# EasyEDA Pro project six-port-baseboard-v01.epro, schematic 六接口底板_V01, sheets 1 to 4 of 12

## Sheets
1 01_FL胎温控制器: Assembly Variant: Basic; Board Name: Board1; Create Date: 2026-10-24; Page Name: P1; Project Name: 六接口中控底板 V0.1 工程样机; Schematic Name: Schematic1; Update Date: 2026-10-24; Company: 嘉立创EDA; Page Size: A4; Version: V1.0
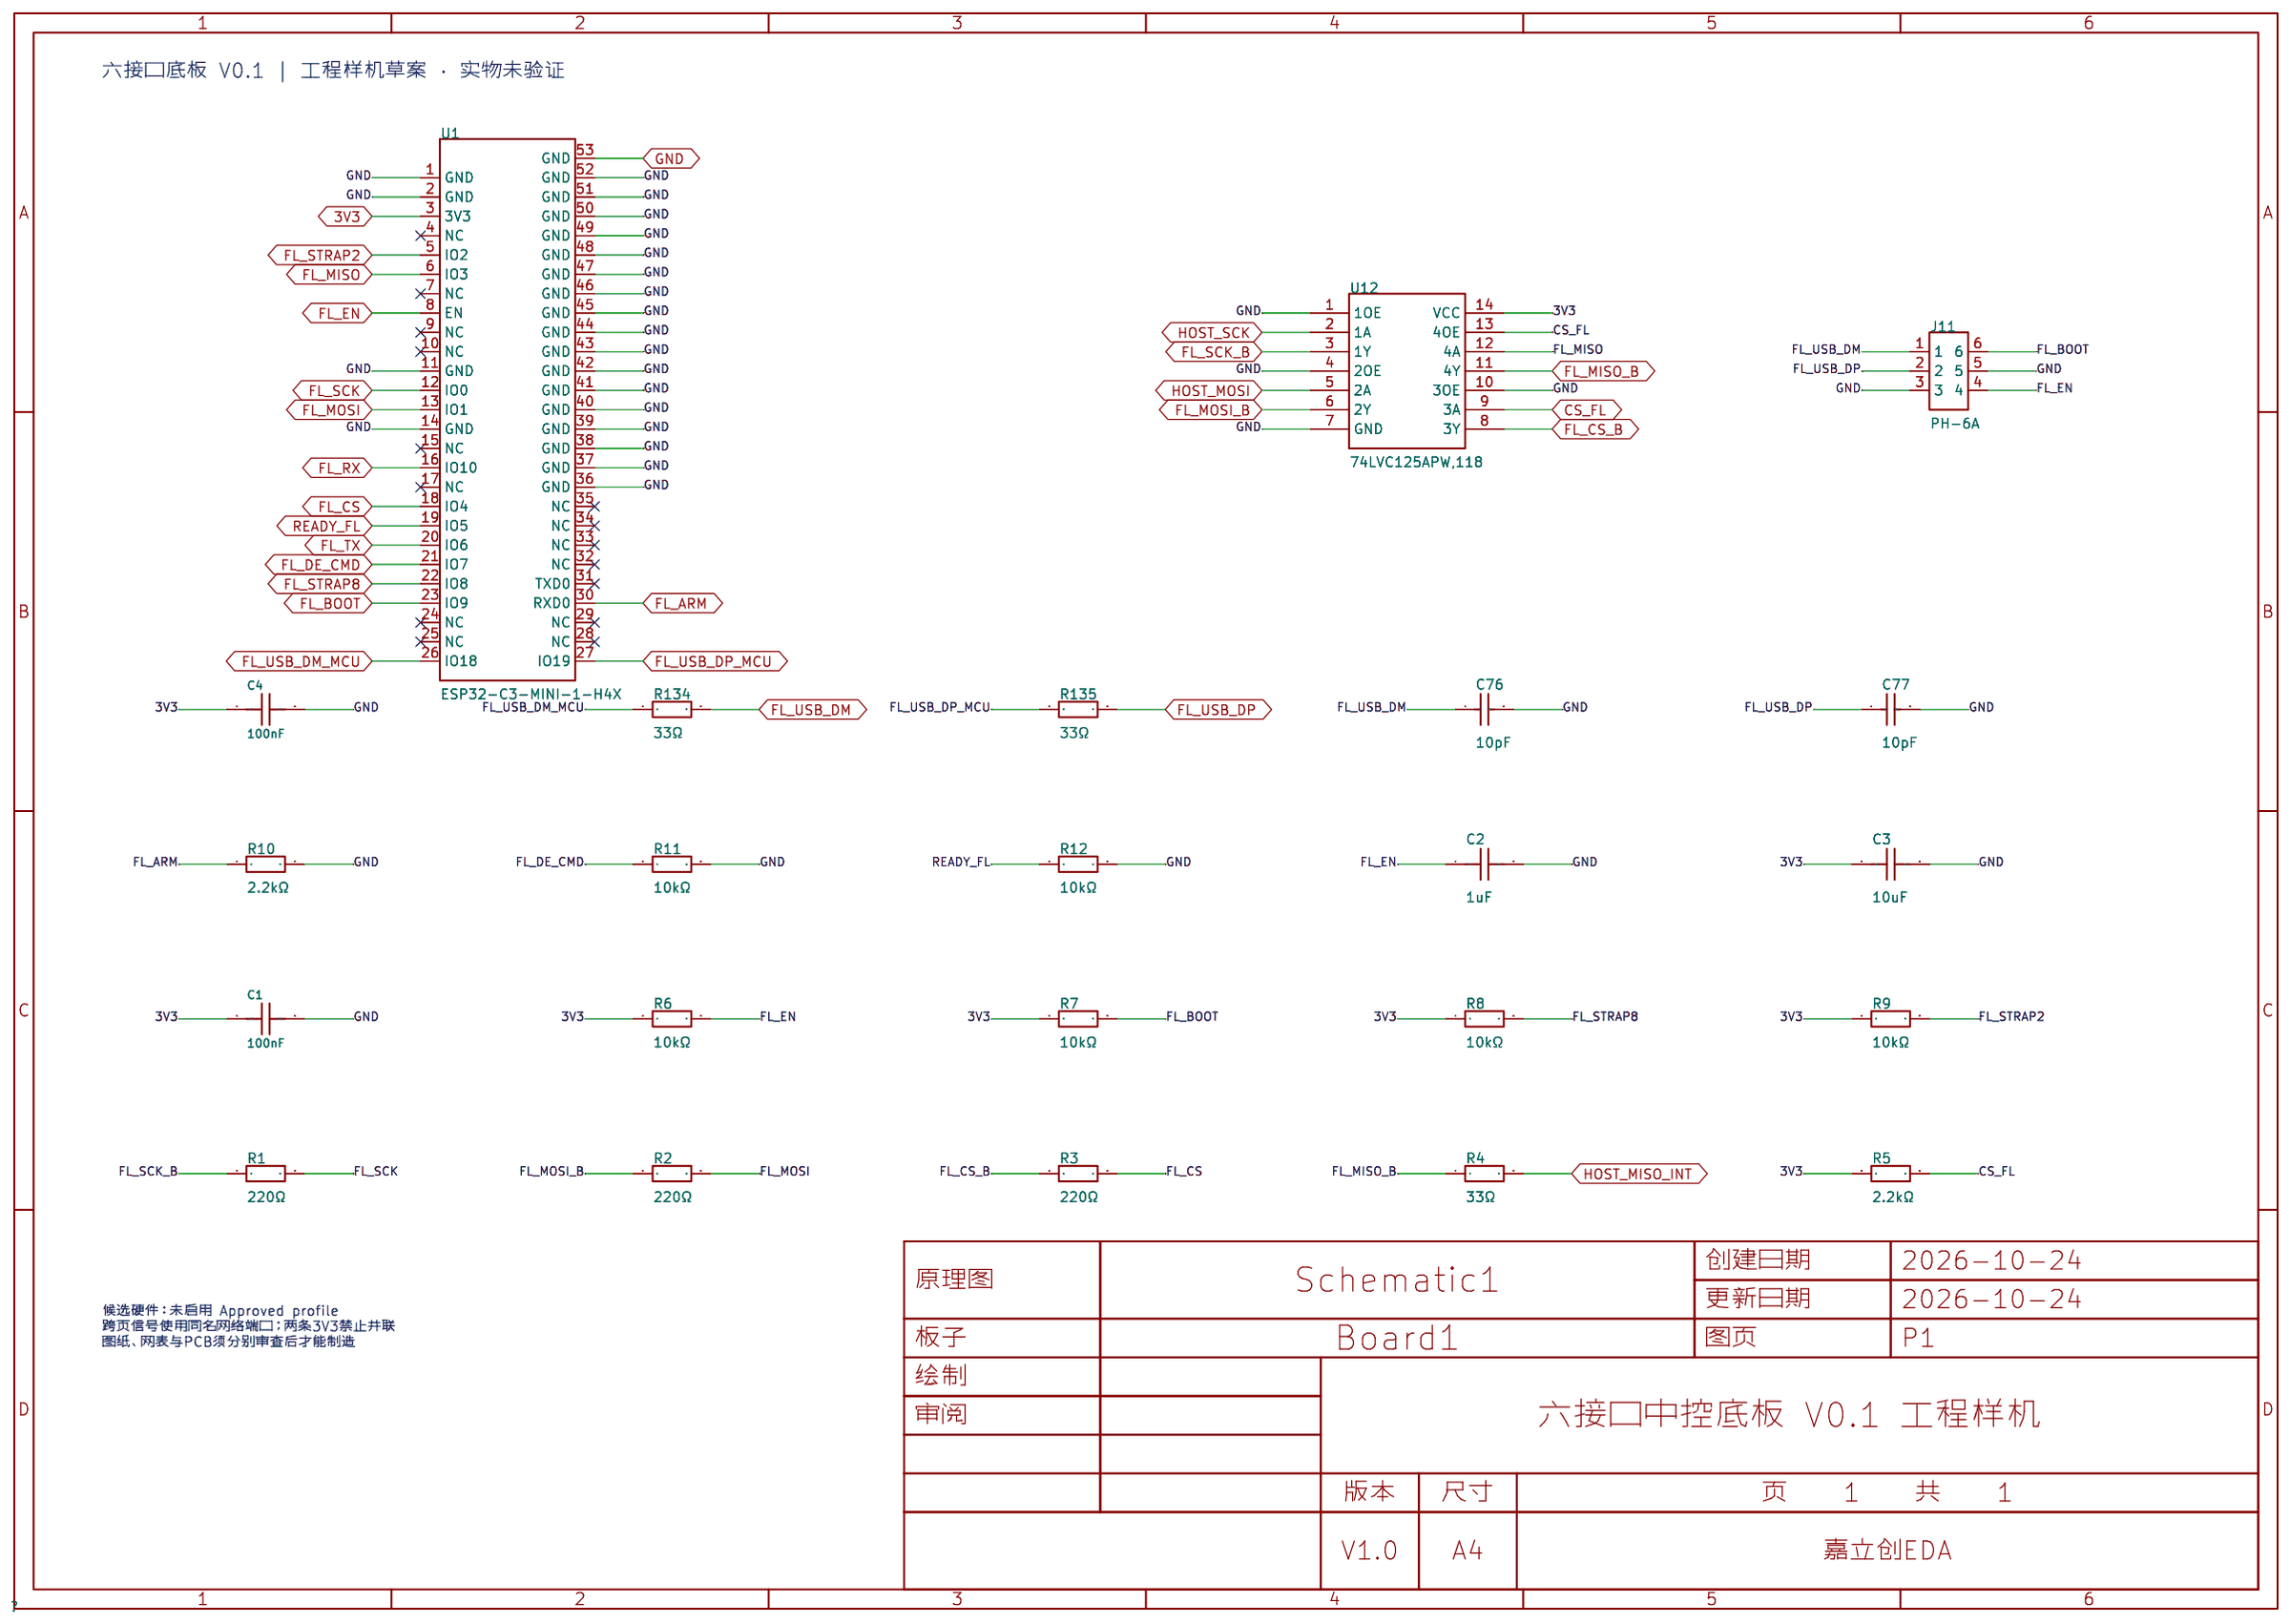
[diagram p0: 01_FL胎温控制器]
2 02_刹车与屏幕接口
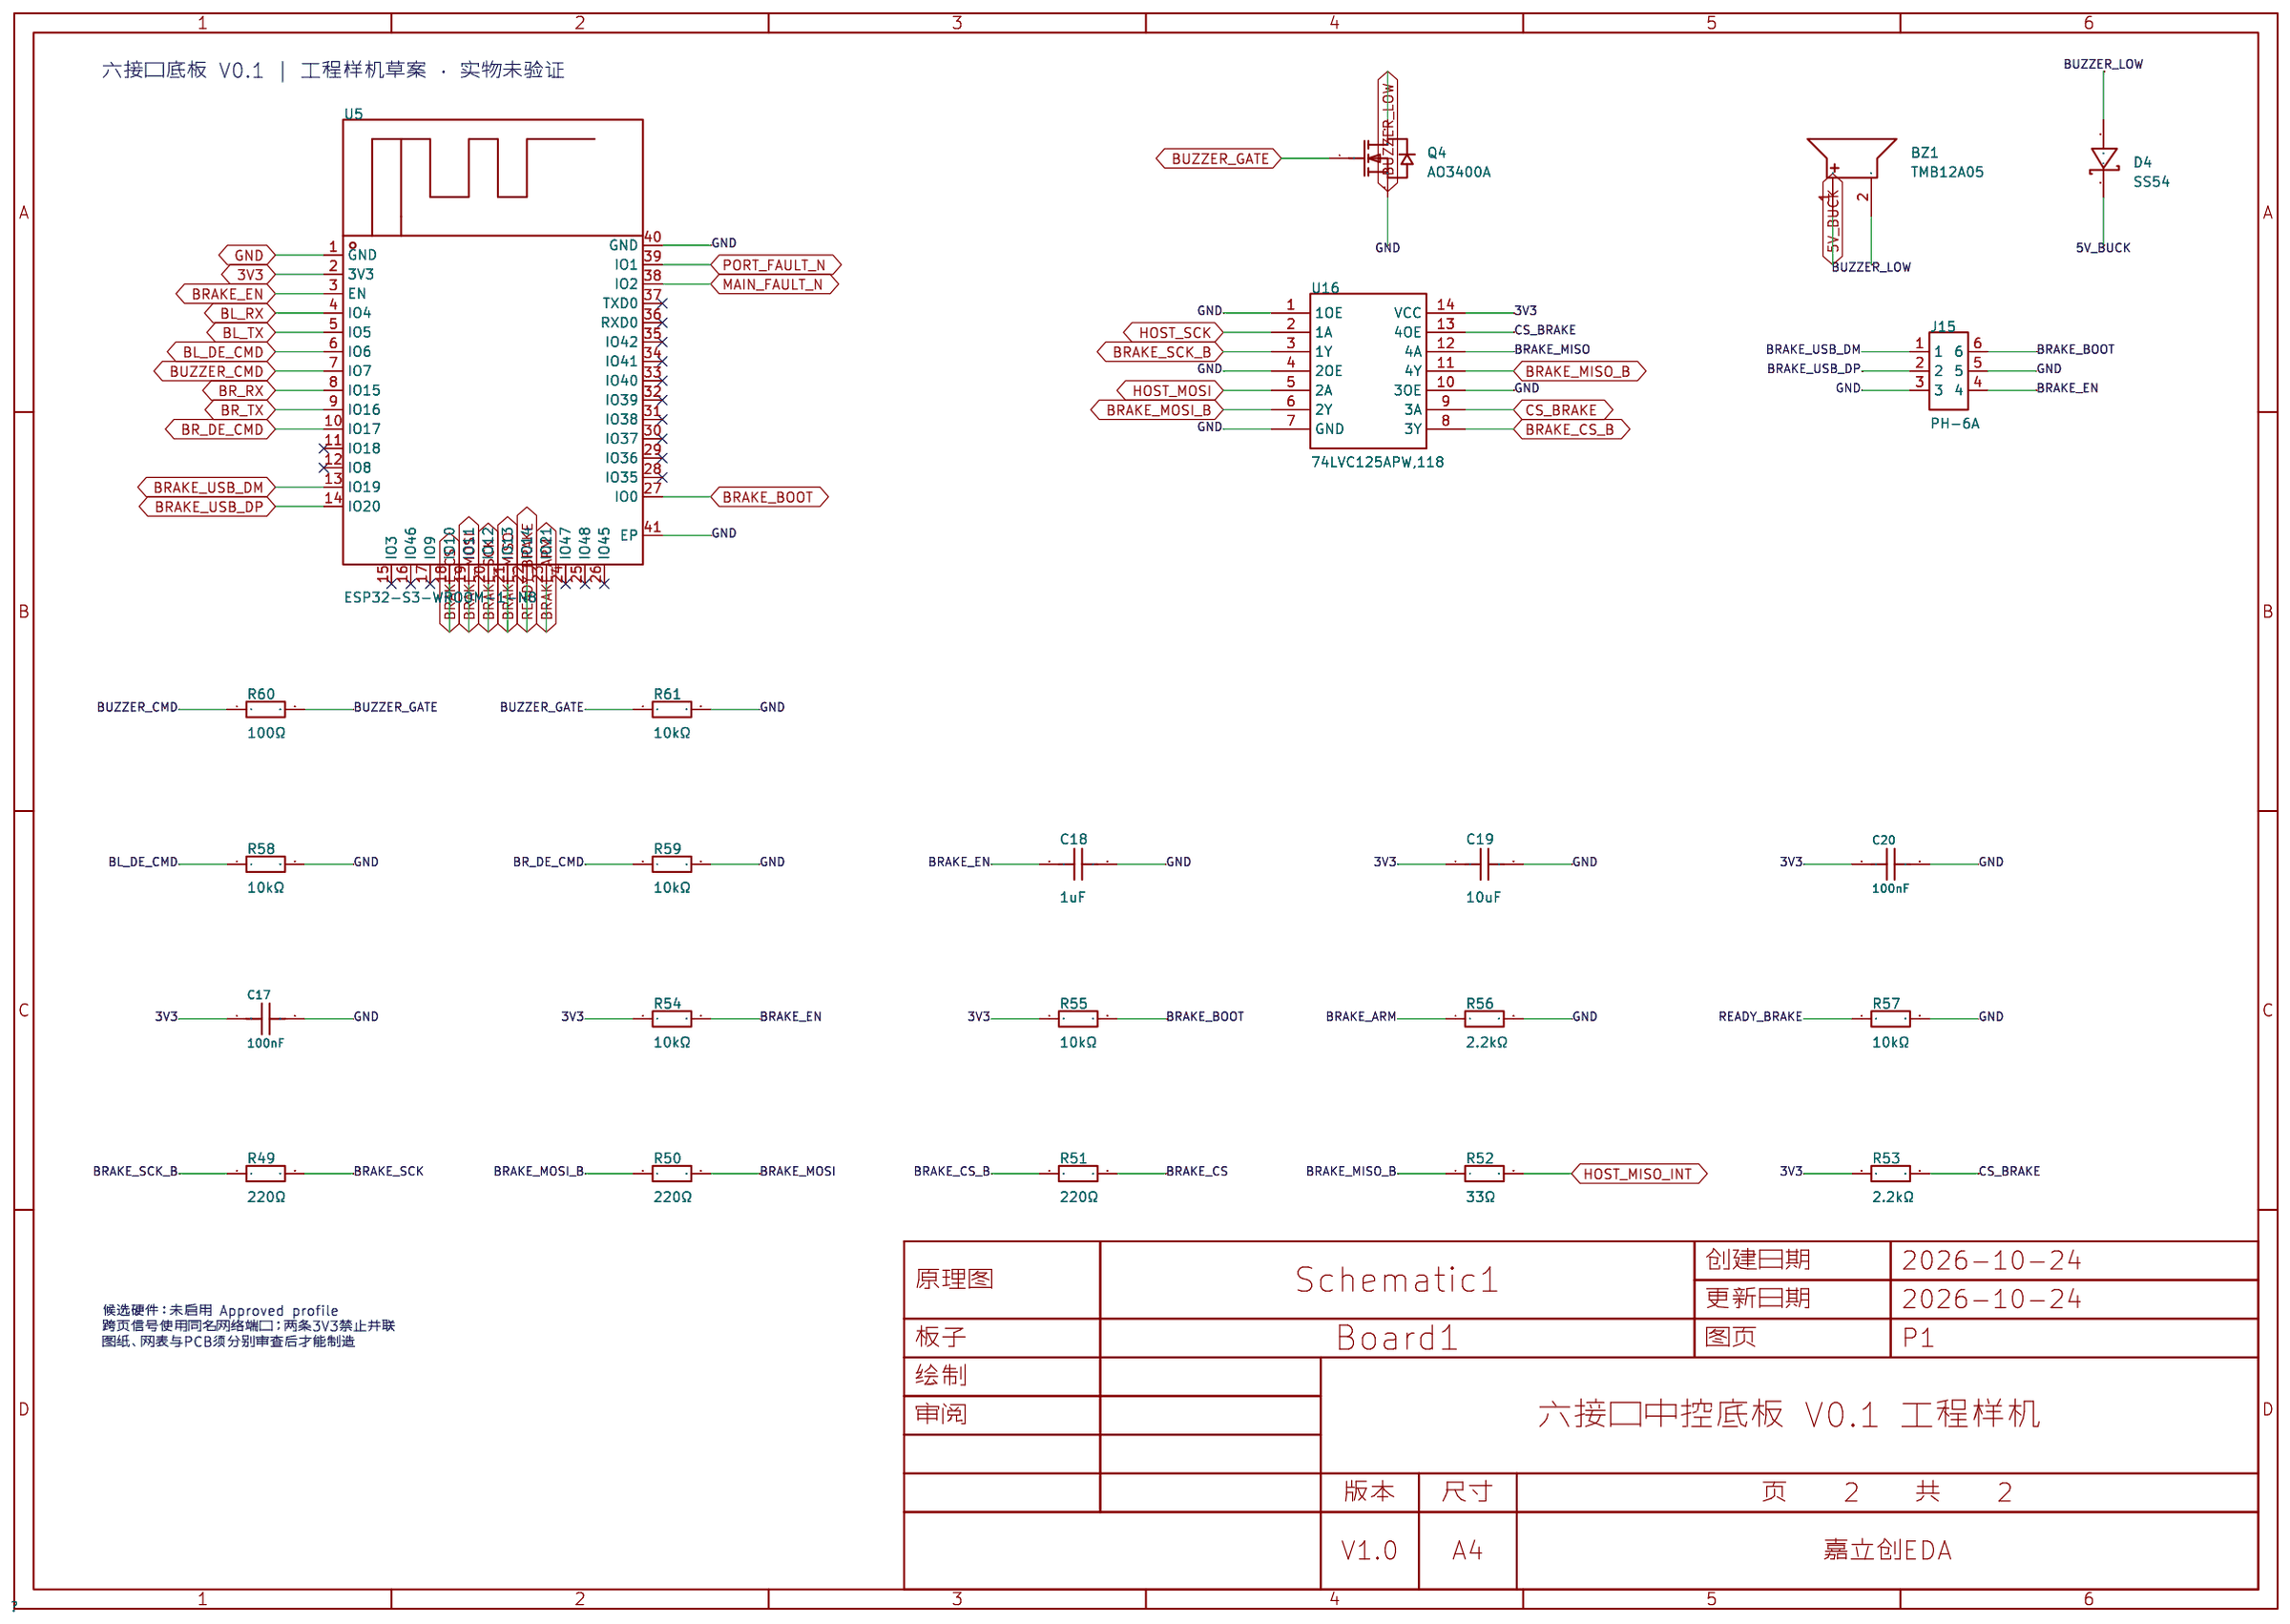
[diagram p1: 02_刹车与屏幕接口]
3 03_六路RS485与支路保护: Schematic Name: 六接口底板_V01
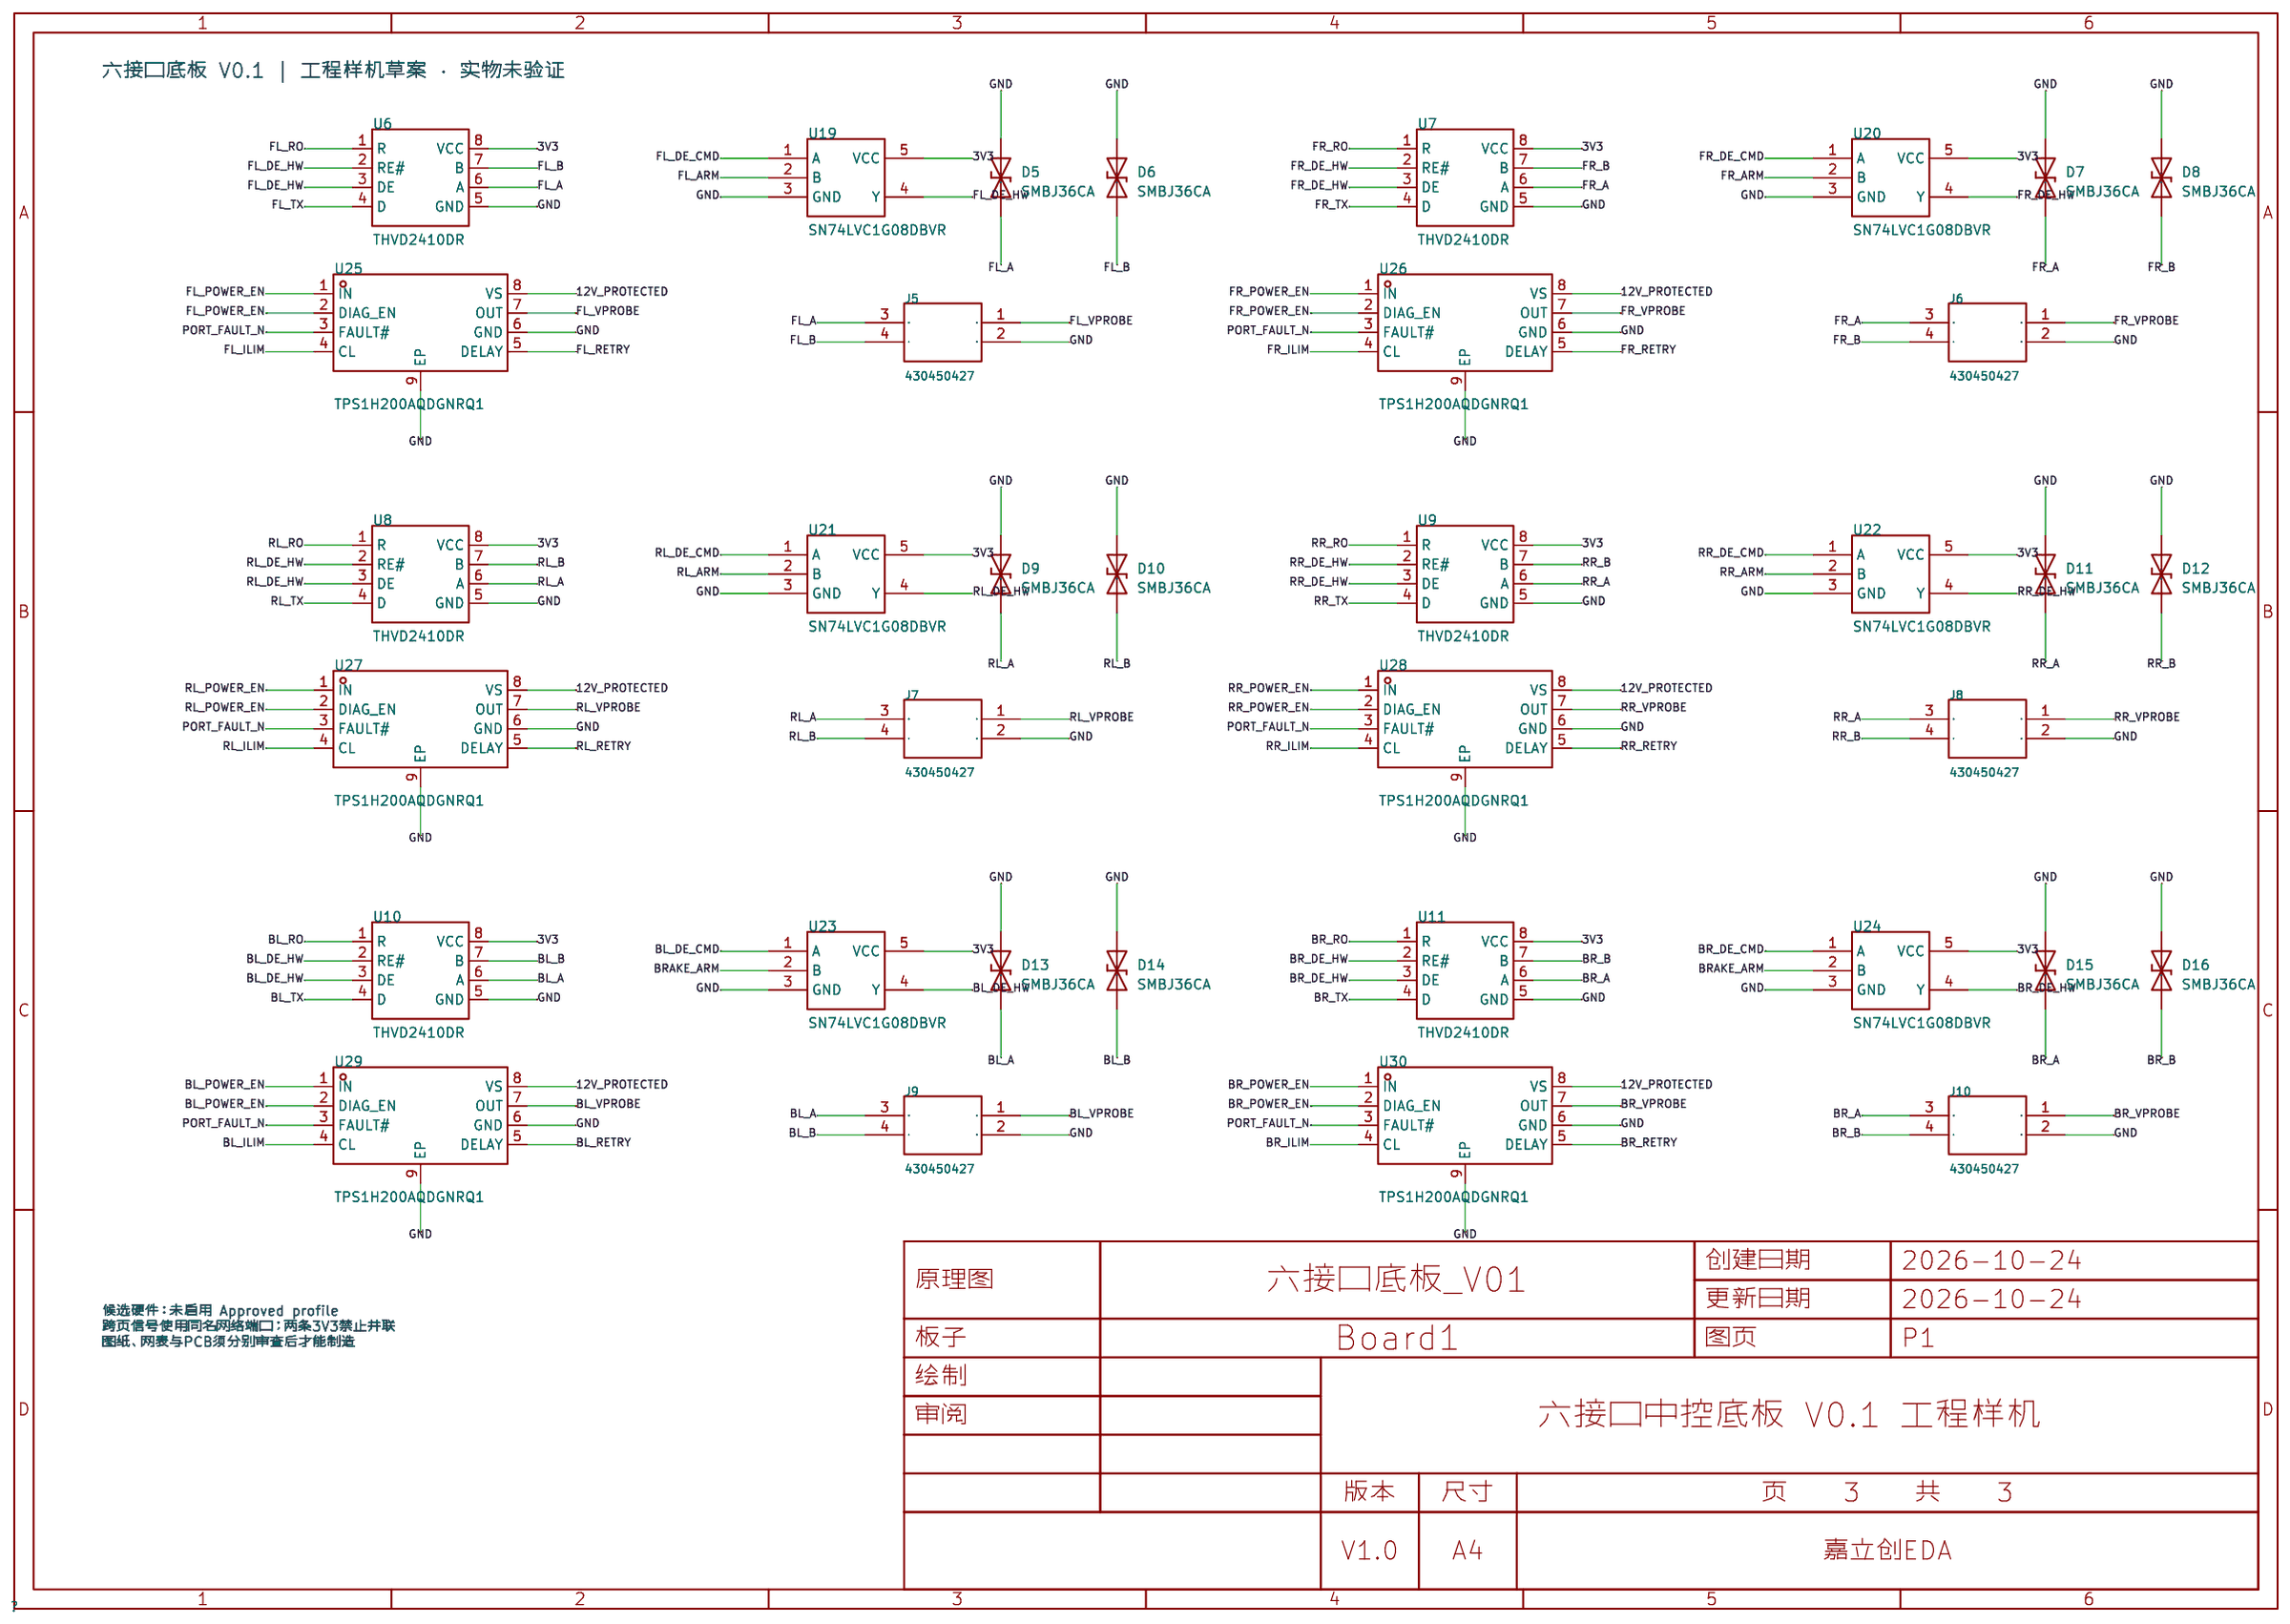
[diagram p2: 03_六路RS485与支路保护]
4 04_车载电源保护: Schematic Name: 六接口底板_V01
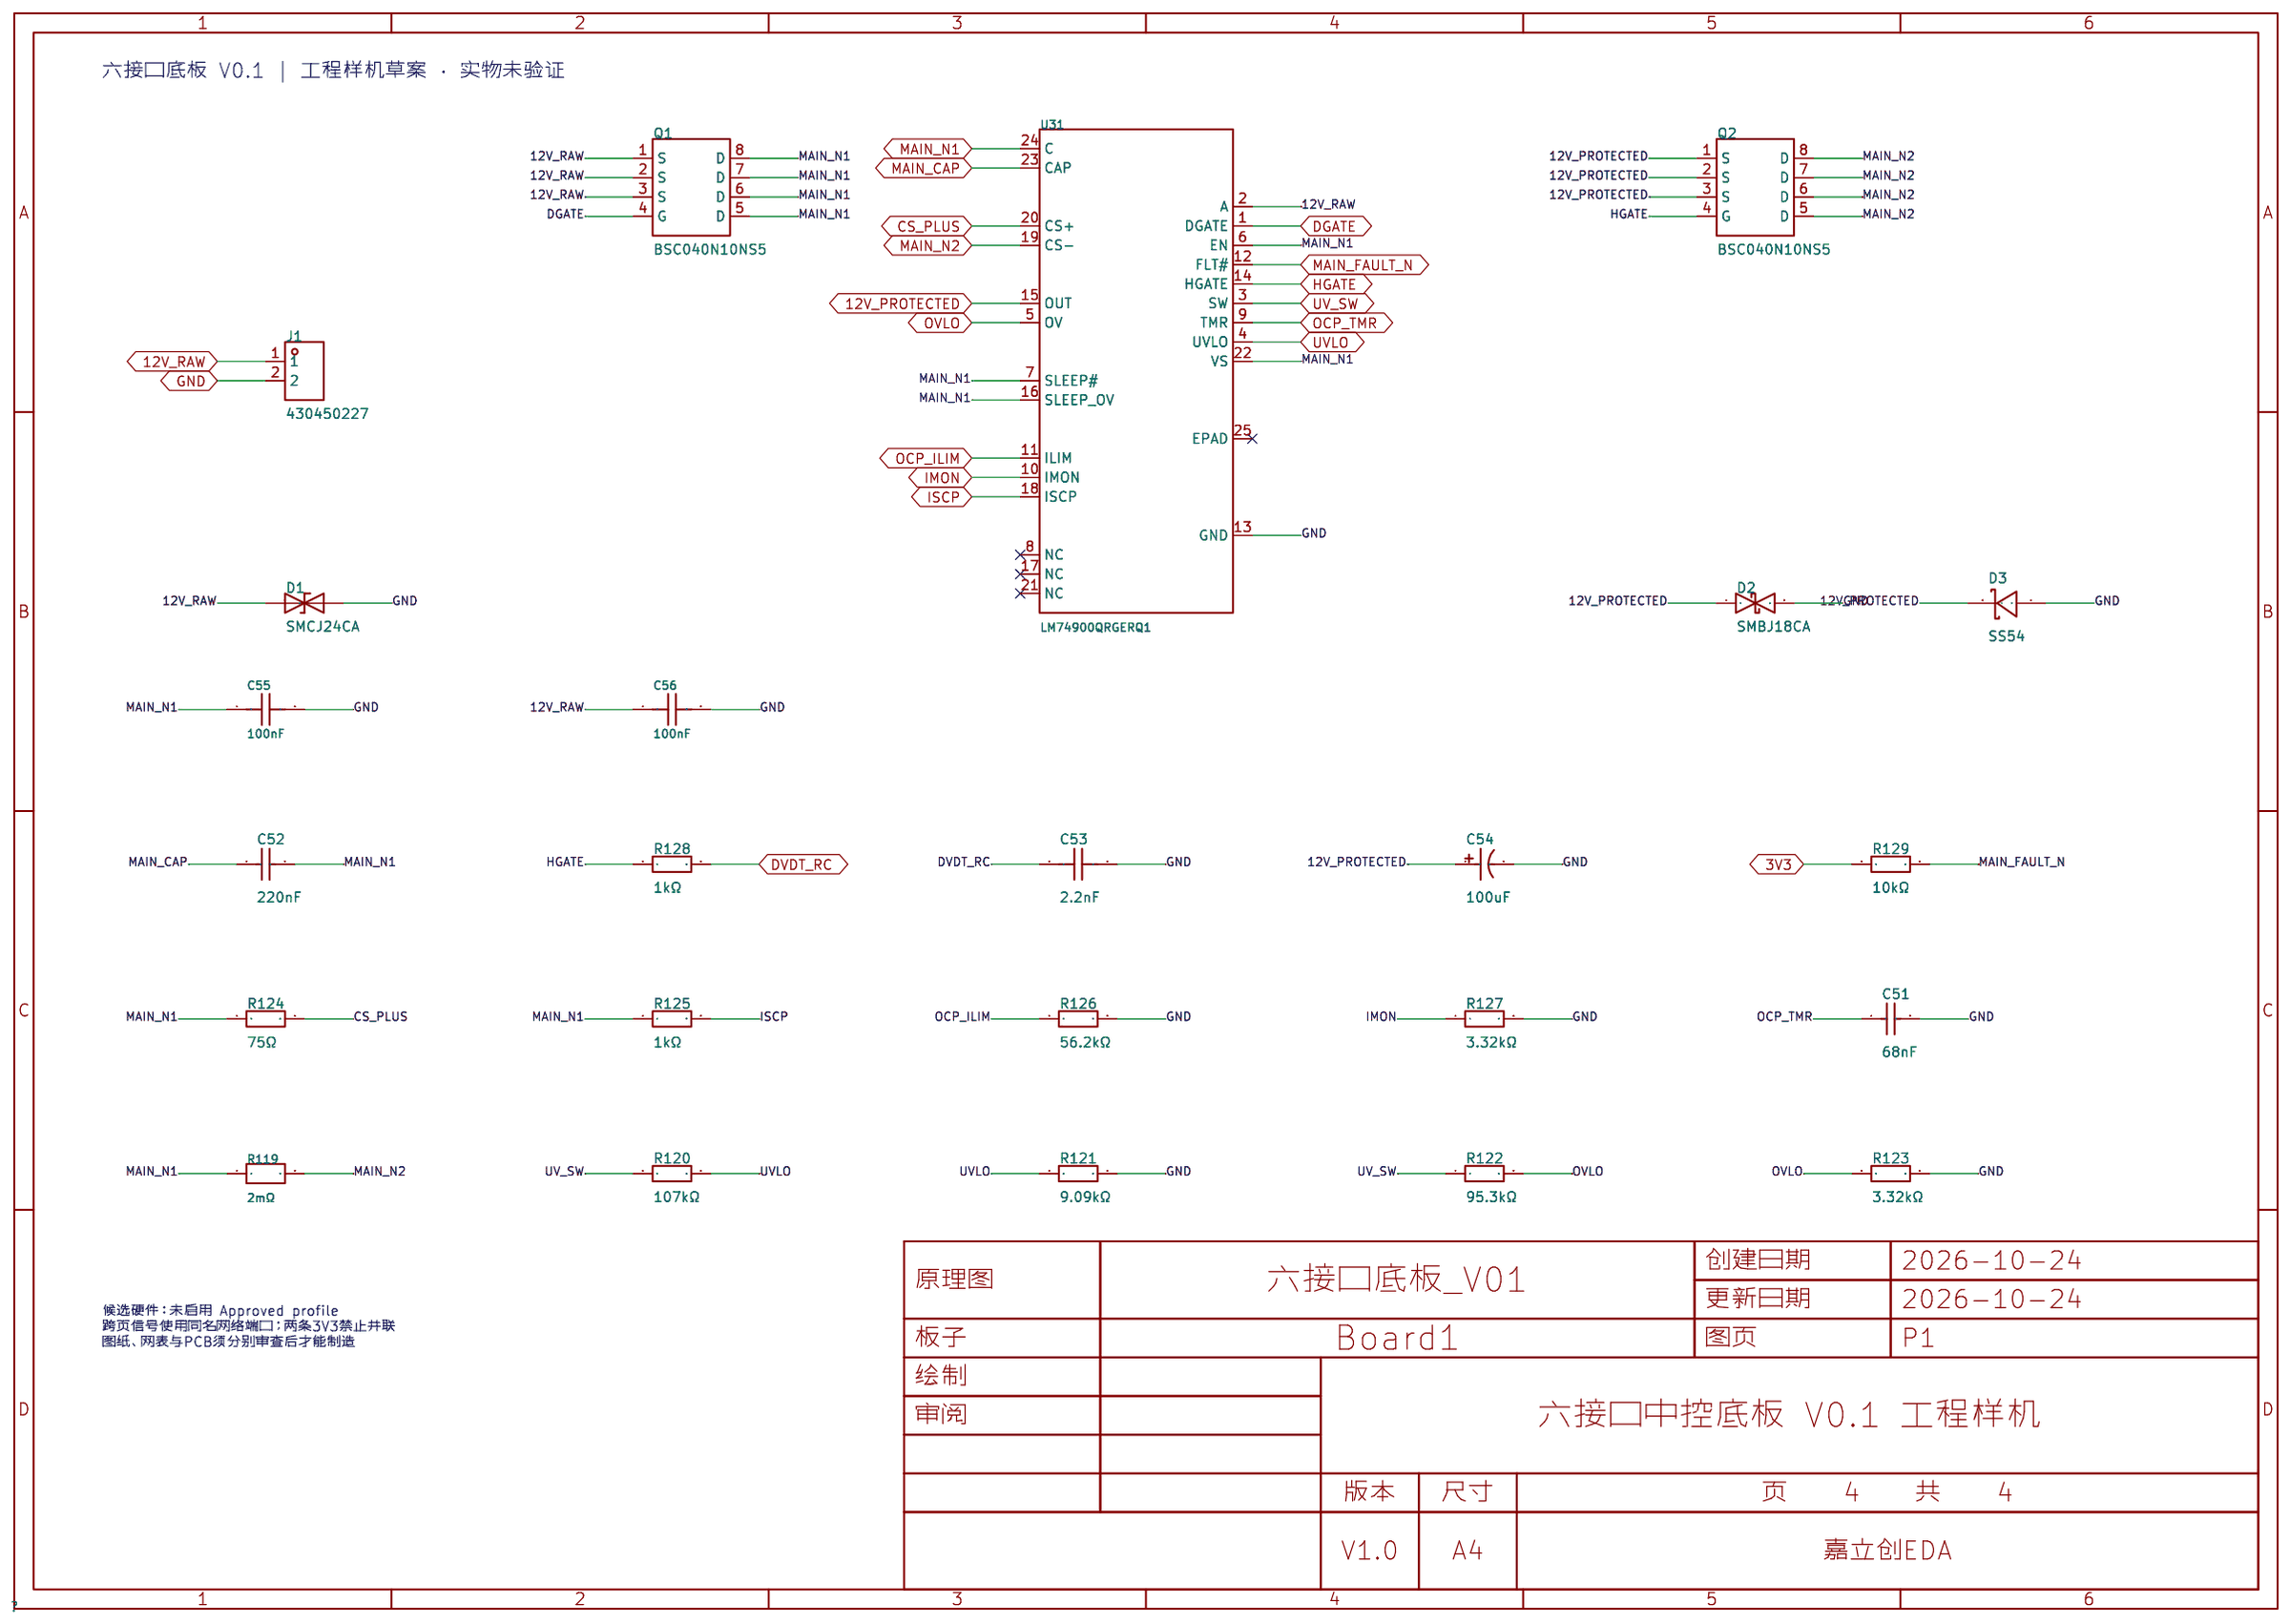
[diagram p3: 04_车载电源保护]

## Parts
sheet 01_FL胎温控制器
C1  100nF  [C0603]
C2  1uF  [C0603]
C3  10uF  [C0805]
C4  100nF  [C0603]
C76  10pF  [C0603]  (no BOM)
C77  10pF  [C0603]  (no BOM)
J11  PH-6A  [CONN-TH_6P-P2.00_B6B-PH-K-1]
R1  220Ω  [R0603]
R2  220Ω  [R0603]
R3  220Ω  [R0603]
R4  33Ω  [R0603]
R5  2.2kΩ  [R0603]
R6  10kΩ  [R0603]
R7  10kΩ  [R0603]
R8  10kΩ  [R0603]
R9  10kΩ  [R0603]
R10  2.2kΩ  [R0603]
R11  10kΩ  [R0603]
R12  10kΩ  [R0603]
R134  33Ω  [R0603]
R135  33Ω  [R0603]
U1  2.4GHz  [WIFIM-SMD_ESP32-C3-MINI-1]
U12  74LVC125APW,118  [TSSOP-14_L5.0-W4.4-P0.65-LS6.4-BL]
sheet 02_刹车与屏幕接口
BZ1  2.4kHz  [BUZ-TH_BD12.0-P7.60-D0.6-FD]
C17  100nF  [C0603]
C18  1uF  [C0603]
C19  10uF  [C0805]
C20  100nF  [C0603]
D4  SS54  [SMA_L4.4-W2.8-LS5.4-R-RD]
J15  PH-6A  [CONN-TH_6P-P2.00_B6B-PH-K-1]
Q4  AO3400A  [SOT-23-3_L2.9-W1.3-P1.90-LS2.4-BR]
R49  220Ω  [R0603]
R50  220Ω  [R0603]
R51  220Ω  [R0603]
R52  33Ω  [R0603]
R53  2.2kΩ  [R0603]
R54  10kΩ  [R0603]
R55  10kΩ  [R0603]
R56  2.2kΩ  [R0603]
R57  10kΩ  [R0603]
R58  10kΩ  [R0603]
R59  10kΩ  [R0603]
R60  100Ω  [R0603]
R61  10kΩ  [R0603]
U5  2.4GHz  [WIFIM-SMD_ESP32-S3-WROOM-1-N8]
U16  74LVC125APW,118  [TSSOP-14_L5.0-W4.4-P0.65-LS6.4-BL]
sheet 03_六路RS485与支路保护
D5  SMBJ36CA  [SMB_L4.6-W3.6-LS5.3-BI]
D6  SMBJ36CA  [SMB_L4.6-W3.6-LS5.3-BI]
D7  SMBJ36CA  [SMB_L4.6-W3.6-LS5.3-BI]
D8  SMBJ36CA  [SMB_L4.6-W3.6-LS5.3-BI]
D9  SMBJ36CA  [SMB_L4.6-W3.6-LS5.3-BI]
D10  SMBJ36CA  [SMB_L4.6-W3.6-LS5.3-BI]
D11  SMBJ36CA  [SMB_L4.6-W3.6-LS5.3-BI]
D12  SMBJ36CA  [SMB_L4.6-W3.6-LS5.3-BI]
D13  SMBJ36CA  [SMB_L4.6-W3.6-LS5.3-BI]
D14  SMBJ36CA  [SMB_L4.6-W3.6-LS5.3-BI]
D15  SMBJ36CA  [SMB_L4.6-W3.6-LS5.3-BI]
D16  SMBJ36CA  [SMB_L4.6-W3.6-LS5.3-BI]
J5  430450427  [CONN-TH_430450427]
J6  430450427  [CONN-TH_430450427]
J7  430450427  [CONN-TH_430450427]
J8  430450427  [CONN-TH_430450427]
J9  430450427  [CONN-TH_430450427]
J10  430450427  [CONN-TH_430450427]
U6  THVD2410DR  [SOIC-8_L4.9-W3.9-P1.27-LS6.0-TL]
U7  THVD2410DR  [SOIC-8_L4.9-W3.9-P1.27-LS6.0-TL]
U8  THVD2410DR  [SOIC-8_L4.9-W3.9-P1.27-LS6.0-TL]
U9  THVD2410DR  [SOIC-8_L4.9-W3.9-P1.27-LS6.0-TL]
U10  THVD2410DR  [SOIC-8_L4.9-W3.9-P1.27-LS6.0-TL]
U11  THVD2410DR  [SOIC-8_L4.9-W3.9-P1.27-LS6.0-TL]
U19  SN74LVC1G08DBVR  [SOT-23-5_L3.0-W1.7-P0.95-LS2.8-BR]
U20  SN74LVC1G08DBVR  [SOT-23-5_L3.0-W1.7-P0.95-LS2.8-BR]
U21  SN74LVC1G08DBVR  [SOT-23-5_L3.0-W1.7-P0.95-LS2.8-BR]
U22  SN74LVC1G08DBVR  [SOT-23-5_L3.0-W1.7-P0.95-LS2.8-BR]
U23  SN74LVC1G08DBVR  [SOT-23-5_L3.0-W1.7-P0.95-LS2.8-BR]
U24  SN74LVC1G08DBVR  [SOT-23-5_L3.0-W1.7-P0.95-LS2.8-BR]
U25  TPS1H200AQDGNRQ1  [EMSOP-8_L3.0-W3.0-P0.65-LS4.9-BL-EP-A]
U26  TPS1H200AQDGNRQ1  [EMSOP-8_L3.0-W3.0-P0.65-LS4.9-BL-EP-A]
U27  TPS1H200AQDGNRQ1  [EMSOP-8_L3.0-W3.0-P0.65-LS4.9-BL-EP-A]
U28  TPS1H200AQDGNRQ1  [EMSOP-8_L3.0-W3.0-P0.65-LS4.9-BL-EP-A]
U29  TPS1H200AQDGNRQ1  [EMSOP-8_L3.0-W3.0-P0.65-LS4.9-BL-EP-A]
U30  TPS1H200AQDGNRQ1  [EMSOP-8_L3.0-W3.0-P0.65-LS4.9-BL-EP-A]
sheet 04_车载电源保护
C51  68nF  [C0603]
C52  220nF  [C0603]
C53  2.2nF  [C0603]
C54  100uF  [CAP-SMD_BD8.0-L8.3-W8.3-FD]
C55  100nF  [C0603]
C56  100nF  [C0603]
D1  SMCJ24CA  [SMC_L6.9-W5.9-LS7.9-BI]
D2  SMBJ18CA  [SMB_L4.6-W3.6-LS5.3-BI]
D3  SS54  [SMA_L4.4-W2.8-LS5.4-R-RD]
J1  430450227  [CONN-TH_43045-0227]
Q1  BSC040N10NS5  [PG-TDSON-8_L5.9-W5.1-P1.27-LS6.1-BL]
Q2  BSC040N10NS5  [PG-TDSON-8_L5.9-W5.1-P1.27-LS6.1-BL]
R119  2mΩ  [RES-SMD_L6.4-W3.2-A]
R120  107kΩ  [R0603]
R121  9.09kΩ  [R0603]
R122  95.3kΩ  [R0603]
R123  3.32kΩ  [R0603]
R124  75Ω  [R0603]
R125  1kΩ  [R0603]
R126  56.2kΩ  [R0603]
R127  3.32kΩ  [R0603]
R128  1kΩ  [R0603]
R129  10kΩ  [R0603]
U31  LM74900QRGERQ1  [VQFN-24_L4.0-W4.0-P0.50-TL-EP2.1_RGE0024T]

## Library data of the parts
C1 C4 C17 C20 C55 C56 = CC0603KRX7R9BB104: 容值:100nF;精度:±10%;额定电压:50V;温度系数:X7R;; LCSC Part Name: 100nF ±10% 50V; Supplier Part: C14663; Manufacturer: YAGEO(国巨); Supplier Footprint: 0603; JLCPCB Part Class: Basic Part; Datasheet: https://item.szlcsc.com/datasheet/CC0603KRX7R9BB104/15331.html; Supplier: LCSC; Tolerance: ±10%; Voltage Rating: 50V; Temperature Coefficient: X7R; Catalog UUID: 96b39256cc3f4d80bd3b503deb4f3328; DNP: false
C2 C18 = CL10A105KB8NNNC: 容值:1uF;精度:±10%;额定电压:50V;温度系数:X5R;; LCSC Part Name: 1uF ±10% 50V; Supplier Part: C15849; Manufacturer: SAMSUNG(三星); Supplier Footprint: 0603; JLCPCB Part Class: Basic Part; Datasheet: https://item.szlcsc.com/datasheet/CL10A105KB8NNNC/16531.html; Supplier: LCSC; Tolerance: ±10%; Voltage Rating: 50V; Temperature Coefficient: X5R; Catalog UUID: f4744ff7405a46a48e360c2c6fadeca3; DNP: false
C3 C19 = CL21A106KAYNNNE_C15850: 容值:10uF;精度:±10%;额定电压:25V;温度系数:X5R;; LCSC Part Name: 10uF ±10% 25V; Supplier Part: C15850; Manufacturer: SAMSUNG(三星); Manufacturer Part: CL21A106KAYNNNE; Supplier Footprint: 0805; JLCPCB Part Class: Basic Part; Datasheet: https://item.szlcsc.com/datasheet/CL21A106KAYNNNE/16532.html; Supplier: LCSC; Tolerance: ±10%; Voltage Rating: 25V; Temperature Coefficient: X5R; Catalog UUID: 8c1f4a9e9d204b148b36ce719c891bd1; DNP: false
C76 C77 = CL10C100JB8NNNC: 容值:10pF;精度:±5%;额定电压:50V;温度系数:C0G;; LCSC Part Name: 10pF ±5% 50V; Supplier Part: C1634; Manufacturer: SAMSUNG(三星); Supplier Footprint: 0603; JLCPCB Part Class: Basic Part; Datasheet: https://item.szlcsc.com/datasheet/CL10C100JB8NNNC/1986.html; Supplier: LCSC; Tolerance: ±5%; Voltage Rating: 50V; Temperature Coefficient: C0G; Catalog UUID: cce6c24475c147de9dedbc04bb9e84e4; DNP: true; Engineering Note: USB tuning10pF reserve; DNP initially; do not fit without signal-integrity validation
J11 = PH-6A: Supplier Part: C9900011373; JLCPCB Part Class: Extended Part; Supplier: LCSC; Catalog UUID: 557868997cb2445e94ef98c066678616; DNP: false; Engineering Note: Native USB jig only; no VBUS or UART0 RX; external 12V supply required
R1-R3 R49-R51 = 0603WAF2200T5E: 电阻类型:厚膜电阻;阻值:220Ω;精度:±1%;功率:100mW;最大工作电压:75V;温度系数:±100ppm/℃;; LCSC Part Name: 220Ω ±1% 100mW 厚膜电阻; Supplier Part: C22962; Manufacturer: UNI-ROYAL(厚声); Supplier Footprint: 0603; JLCPCB Part Class: Basic Part; Datasheet: https://atta.szlcsc.com/upload/public/pdf/source/20200306/C422600_1E6D84923E4A46A82E41ADD87F860B5C.pdf; Supplier: LCSC; Type: 厚膜电阻; Tolerance: ±1%; Power(Watts): 100mW; Overload Voltage (Max): 75V; Temperature Coefficient: ±100ppm/℃; Operating Temperature Range: -55℃~+155℃; Catalog UUID: 5838c5089bf2441c9c491337f593e7a2; DNP: false
R4 R52 = 0603WAF330JT5E: 电阻类型:厚膜电阻;阻值:33Ω;精度:±1%;功率:100mW;工作电压:75V;温度系数:±100ppm/℃;; LCSC Part Name: 33Ω ±1% 100mW 厚膜电阻; Supplier Part: C23140; Manufacturer: UNI-ROYAL(厚声); Supplier Footprint: 0603; JLCPCB Part Class: Basic Part; Datasheet: https://item.szlcsc.com/datasheet/0603WAF330JT5E/23867.html; Supplier: LCSC; Type: 厚膜电阻; Tolerance: ±1%; Power(Watts): 100mW; Voltage-Supply(Max): 75V; Temperature Coefficient: ±100ppm/℃; Operating Temperature: -55℃~+155℃; Catalog UUID: c1b17fa23f304726bc91c5924d9b7c0f; DNP: false
R5 R10 R53 R56 = 0603WAF2201T5E: 电阻类型:厚膜电阻;阻值:2.2kΩ;精度:±1%;功率:100mW;工作电压:75V;温度系数:±100ppm/℃;; LCSC Part Name: 厚膜电阻 2.2kΩ ±1%; Supplier Part: C4190; Manufacturer: UNI-ROYAL(厚声); Supplier Footprint: 0603; JLCPCB Part Class: Basic Part; Datasheet: https://item.szlcsc.com/datasheet/0603WAF2201T5E/4597.html; Supplier: LCSC; Type: 厚膜电阻; Tolerance: ±1%; Power(Watts): 100mW; Voltage-Supply(Max): 75V; Temperature Coefficient: ±100ppm/℃; Operating Temperature: -55℃~+155℃; Catalog UUID: 98df714a70bd4b05a6b4009c95d1c8aa; DNP: false
R6-R9 R11 R12 R54 R55 R57-R59 R61 R129 = 0603WAF1002T5E: 电阻类型:厚膜电阻;阻值:10kΩ;精度:±1%;功率:100mW;工作电压:75V;温度系数:±100ppm/℃;; LCSC Part Name: 厚膜电阻 10kΩ ±1% 100mW; Supplier Part: C25804; Manufacturer: UNI-ROYAL(厚声); Supplier Footprint: 0603; JLCPCB Part Class: Basic Part; Datasheet: https://item.szlcsc.com/datasheet/0603WAF1002T5E/26547.html; Supplier: LCSC; Type: 厚膜电阻; Tolerance: ±1%; Power(Watts): 100mW; Voltage-Supply(Max): 75V; Temperature Coefficient: ±100ppm/℃; Operating Temperature: -55℃~+155℃; Catalog UUID: b948db94476e4027ac8953235755ec96; DNP: false
R134 R135 = 0603WAF330JT5E: 电阻类型:厚膜电阻;阻值:33Ω;精度:±1%;功率:100mW;工作电压:75V;温度系数:±100ppm/℃;; LCSC Part Name: 33Ω ±1% 100mW 厚膜电阻; Supplier Part: C23140; Manufacturer: UNI-ROYAL(厚声); Supplier Footprint: 0603; JLCPCB Part Class: Basic Part; Datasheet: https://item.szlcsc.com/datasheet/0603WAF330JT5E/23867.html; Supplier: LCSC; Type: 厚膜电阻; Tolerance: ±1%; Power(Watts): 100mW; Voltage-Supply(Max): 75V; Temperature Coefficient: ±100ppm/℃; Operating Temperature: -55℃~+155℃; Catalog UUID: c1b17fa23f304726bc91c5924d9b7c0f; Engineering Note: USB source termination33ohm
U1 = ESP32-C3-MINI-1-H4X: 核心芯片:ESP32-C3FH4;频率:2.4GHz;天线形式:板载PCB天线;发射功率:20.5dBm;接收灵敏度:-104dBm;; LCSC Part Name: 不带固件 支持2.4GHz Wi-Fi和蓝牙5的小尺寸模组; Supplier Part: C41349510; Manufacturer: ESPRESSIF(乐鑫); Supplier Footprint: SMD,16.6x13.2mm; JLCPCB Part Class: Extended Part; Datasheet: https://item.szlcsc.com/datasheet/ESP32-C3-MINI-1-H4X/43083447.html; Supplier: LCSC; Utilized IC / Part: ESP32-C3FH4; Interface Type: I2C；GPIO；UART；SPI；USB；I2S; Antenna Type: 板载PCB天线; Output Power: 20.5dBm; Voltage - Supply: 3V~3.6V; Receive  Current: 82mA; Send  Current: 350mA; Sensitivity: -104dBm; Operating Temperature: -40℃~+105℃; Features: 集成蓝牙功能; DNP: false; Engineering Note: GPIO20 ARM 2.2k pulldown; UART0 RX must not connect external UART TX; Catalog UUID: 3a2c95bbb66e4a86b29302666ff8e443
U12 U16 = 74LVC125APW,118: 输入类型:施密特触发器;工作电压:1.2V~3.6V;元件数:4;每个元件位数:1;灌电流(IOL):24mA;拉电流(IOH):24mA;; LCSC Part Name: 三态输出，带5V容限输入/输出的四路缓冲器/线路驱动器; Supplier Part: C6059; Manufacturer: Nexperia(安世); Supplier Footprint: TSSOP-14; JLCPCB Part Class: Extended Part; Datasheet: https://item.szlcsc.com/datasheet/74LVC125APW%252C118/6525.html; Supplier: LCSC; Input type: 施密特触发器; output type: 三态; Voltage - Supply: 1.2V~3.6V; Number of Elements: 4; Number of Bits per Element: 1; Channel Type: 单向; Current - Output Low(IOL): 24mA; Current - Output High(IOH): 24mA; Logic Family: 74LVC; Operating Temperature: -40℃~+125℃; Quiescent Current: 40uA; Propagation Delay: 2.5ns@3.3V,50pF; Features: 掉电隔离；输出使能；电平转换; Catalog UUID: dd4b769d406d4d4e9b0e38748c7cdf43; DNP: false
BZ1 = TMB12A05: 驱动方式:有源(内含驱动线路);构造类型:电磁式;额定电压:5V;频率:2.4kHz;声压(SPL):88dB;; LCSC Part Name: 有源电磁式蜂鸣器; Supplier Part: C781860; Manufacturer: YUEXIN(悦馨); Supplier Footprint: 插件,D=12mm; JLCPCB Part Class: Extended Part; Datasheet: https://item.szlcsc.com/datasheet/TMB12A05/834376.html; Supplier: LCSC; Driver Circuitry: 有源(内含驱动线路); Technology: 电磁式; Voltage Rating: 5V; Voltage - Supply: 4V~8V; Current Consumption: 30mA; Sound Pressure Level(SPL): 88dB; Diameter(φD): 12mm; Height: 9.5mm; Operating Temperature: -30℃~+85℃; Mounting Type: 插件; Catalog UUID: 21989be0f242489086523a63d41e04d7; DNP: false; Engineering Note: Active 5V 30mA; audio hole / actual sound level must be verified
D4 = SS54_C22452: 二极管配置:独立式;正向压降(Vf):550mV@5A;直流反向耐压(Vr):40V;整流电流:5A;; LCSC Part Name: 电压:40V 电流:5A; Supplier Part: C22452; Manufacturer: MDD(辰达半导体); Supplier Footprint: SMA(DO-214AC); JLCPCB Part Class: Basic Part; Datasheet: https://item.szlcsc.com/datasheet/SS54/23178.html; Supplier: LCSC; Diode Configuration: 独立式; Voltage - Forward(Vf@If): 550mV@5A; Voltage - DC Reverse(Vr): 40V; Current - Rectified: 5A; Reverse Leakage Current (Ir): 1mA@40V; Operating Junction Temperature Range: -55℃~+125℃; Catalog UUID: 7e4971a287384663bb1defa327c587af; DNP: false; Engineering Note: Read-back library pin1=A pin2=K: cathode to +5V
J15 = PH-6A: Supplier Part: C9900011373; JLCPCB Part Class: Extended Part; Supplier: LCSC; Catalog UUID: 557868997cb2445e94ef98c066678616; DNP: false
Q4 = AO3400A_C20917: 数量:1个N沟道;漏源电压(Vdss):30V;连续漏极电流(Id):5.7A;导通电阻(RDS(on)):48mΩ@2.5V;耗散功率(Pd):1.4W;阈值电压(Vgs(th)):1.45V;; LCSC Part Name: N沟道 耐压:30V; Supplier Part: C20917; Manufacturer: AOS; Supplier Footprint: SOT-23; JLCPCB Part Class: Basic Part; Datasheet: https://item.szlcsc.com/datasheet/AO3400A/21629.html; Supplier: LCSC; Number: 1个N沟道; Drain to Source Voltage: 30V; Current - Continuous Drain(Id): 5.7A; RDS(on): 48mΩ@2.5V; Pd - Power Dissipation: 1.4W; Gate Threshold Voltage (Vgs(th)): 1.45V; Gate Charge(Qg): 7nC@10V; Input Capacitance(Ciss): 630pF; Reverse Transfer Capacitance (Crss@Vds): 50pF; Operating Temperature: -55℃~+150℃; Type: N沟道; Output Capacitance(Coss): 75pF; Vgs: ±12V; Catalog UUID: 2b6cc05daeb34c16b9e00706a375fc9f; DNP: false
R60 = 0603WAF1000T5E: 电阻类型:厚膜电阻;阻值:100Ω;精度:±1%;功率:100mW;最大工作电压:75V;温度系数:±200ppm/℃;; LCSC Part Name: 100Ω ±1% 100mW 厚膜电阻; Supplier Part: C22775; Manufacturer: UNI-ROYAL(厚声); Supplier Footprint: 0603; JLCPCB Part Class: Basic Part; Datasheet: https://atta.szlcsc.com/upload/public/pdf/source/20200306/C422600_1E6D84923E4A46A82E41ADD87F860B5C.pdf; Supplier: LCSC; Type: 厚膜电阻; Tolerance: ±1%; Power(Watts): 100mW; Overload Voltage (Max): 75V; Temperature Coefficient: ±200ppm/℃; Operating Temperature Range: -55℃~+155℃; Catalog UUID: 5303080f43d74b41ae76fc5142aa97e5; DNP: false
U5 = ESP32-S3-WROOM-1-N8: 核心芯片:ESP32-S3芯片;频率:2.4GHz;天线形式:板载PCB天线;发射功率:20.5dBm;接收灵敏度:-98.2dBm;; LCSC Part Name: 不带固件 通用型Wi-Fi+低功耗蓝牙MCU模组; Supplier Part: C2913198; Manufacturer: ESPRESSIF(乐鑫); Supplier Footprint: SMD,25.5x18mm; JLCPCB Part Class: Extended Part; Datasheet: https://item.szlcsc.com/datasheet/ESP32-S3-WROOM-1-N8/3198296.html; Supplier: LCSC; Utilized IC / Part: ESP32-S3芯片; Wireless Standard: Bluetooth5.0; Interface Type: SPI；I2S；USB；I2C；UART; Antenna Type: 板载PCB天线; Output Power: 20.5dBm; Voltage - Supply: 3V~3.6V; Receive  Current: 95mA; Send  Current: 355mA; Sensitivity: -98.2dBm; Operating Temperature: -40℃~+85℃; DNP: false
D5 D6 D8-D16 = SMBJ36CA: 极性:双向;反向截止电压(Vrwm):36V;钳位电压:58.1V;峰值脉冲电流(Ipp):10.4A;峰值脉冲功率(Ppp):600W@10/1000us;击穿电压(VBR):44.2V;; LCSC Part Name: 双向TVS 36V截止 峰值浪涌电流：10.4A; Supplier Part: C294913; Manufacturer: SEMIWARE(赛米微尔); Supplier Footprint: DO-214AA(SMB); JLCPCB Part Class: Extended Part; Datasheet: https://item.szlcsc.com/datasheet/SMBJ36CA/279455.html; Supplier: LCSC; Polarity: 双向; Reverse Stand-Off Voltage (Vrwm): 36V; Clamping Voltage: 58.1V; Peak Pulse Current (Ipp): 10.4A; Peak Pulse Power Dissipation (Ppp): 600W@10/1000us; Voltage - Breakdown: 44.2V; Reverse Leakage Current (Ir): 1uA; Number of Channels: 单路; Operating Temperature: -55℃~+125℃; Type: TVS; Catalog UUID: a30f5a4ff3ed4198ae5524fd5dce2551; DNP: false
D7 = SMBJ36CA: 极性:双向;反向截止电压(Vrwm):36V;钳位电压:58.1V;峰值脉冲电流(Ipp):10.4A;峰值脉冲功率(Ppp):600W@10/1000us;击穿电压(VBR):44.2V;; LCSC Part Name: 双向TVS 36V截止 峰值浪涌电流：10.4A; Supplier Part: C294913; Manufacturer: SEMIWARE(赛米微尔); Supplier Footprint: DO-214AA(SMB); JLCPCB Part Class: Extended Part; Datasheet: https://item.szlcsc.com/datasheet/SMBJ36CA/279455.html; Supplier: LCSC; Polarity: 双向; Reverse Stand-Off Voltage (Vrwm): 36V; Clamping Voltage: 58.1V; Peak Pulse Current (Ipp): 10.4A; Peak Pulse Power Dissipation (Ppp): 600W@10/1000us; Voltage - Breakdown: 44.2V; Reverse Leakage Current (Ir): 1uA; Number of Channels: 单路; Operating Temperature: -55℃~+125℃; Type: TVS; DNP: false
J5-J10 = 430450427: 插针结构:2x2P;间距:3mm;安装方式:直插;参考系列:Micro-Fit(MX 3.0);总PIN数:4P;排数:2;每排PIN数:2;行距:3mm;额定电流:8.5A;触头材质:黄铜;触头镀层:锡;工作温度:-40℃~+105℃;; LCSC Part Name: 2x2P 间距:3mm 直插 系列:Micro-Fit(MX 3.0); Supplier Part: C293536; Manufacturer: MOLEX; Supplier Footprint: 插件,P=3mm; JLCPCB Part Class: Extended Part; Datasheet: https://www.molex.com/content/dam/molex/molex-dot-com/products/automated/en-us/salesdrawingpdf/430/43045/430450427_sd.pdf?inline\; Supplier: LCSC; Pins Structure: 2x2P; Pitch: 3mm; Mounting Type: 直插; Reference Series: Micro-Fit(MX 3.0); Number of Pins: 4P; Number of Rows: 2; Number of PINs Per Row: 2; Row Spacing: 3mm; Current Rating: 8.5A; Contact Material: 黄铜; Contact Plating: 锡; Operating Temperature: -40℃~+105℃; Voltage Rating: 600V; Flame Retardant Rating: UL94V-0; Supplementary Features: 带柱; Color: 黑色; Z-Height of the Board: 9.91mm; X-Length of Bottom Edge on Board (Spacing Line): 9.65mm; Y-Width of Bottom Edge on Board: 8.77mm; Catalog UUID: 8a75d23bf49041cf9a65bd4267b2027a; DNP: false; Engineering Note: Vertical MicroFit; confirm numbering/view and real probe adapter before crimping
U6 = THVD2410DR: 类型:收发器;数据速率:500Kbps;; LCSC Part Name: THVD2410半双工RS-485收发器; Supplier Part: C1849398; Manufacturer: TI(德州仪器); Supplier Footprint: SOIC-8; JLCPCB Part Class: Extended Part; Datasheet: https://www.ti.com/cn/lit/ds/symlink/thvd2450.pdf; Supplier: LCSC; Type: 收发器; Number of Drivers: 1; Number of Receivers: 1; Voltage - Supply: 3V~5.5V; Data Rate: 500Kbps; Number of Nodes: 256; ESD Protect: ±16kV; Operating Temperature: -40℃~+125℃; Quiescent Supply Current: 1uA; Communication Mode: 半双工; Features: Tx/Rx启用；热关断保护；失效保护；使能关断；过流保护；低功耗模式; DNP: false
U7-U11 = THVD2410DR: 类型:收发器;数据速率:500Kbps;; LCSC Part Name: THVD2410半双工RS-485收发器; Supplier Part: C1849398; Manufacturer: TI(德州仪器); Supplier Footprint: SOIC-8; JLCPCB Part Class: Extended Part; Datasheet: https://www.ti.com/cn/lit/ds/symlink/thvd2450.pdf; Supplier: LCSC; Type: 收发器; Number of Drivers: 1; Number of Receivers: 1; Voltage - Supply: 3V~5.5V; Data Rate: 500Kbps; Number of Nodes: 256; ESD Protect: ±16kV; Operating Temperature: -40℃~+125℃; Quiescent Supply Current: 1uA; Communication Mode: 半双工; Features: Tx/Rx启用；热关断保护；失效保护；使能关断；过流保护；低功耗模式; Catalog UUID: a0f2661d454c4ce0b14a62da4442583b; DNP: false
U19-U24 = SN74LVC1G08DBVR: 逻辑类型:与门;门电路数量:1;工作电压:1.65V~5.5V;静态电流(Iq):10uA;传播延迟(tpd):4ns@5V,50pF;; LCSC Part Name: 单路 2 输入正与门; Supplier Part: C7666; Manufacturer: TI(德州仪器); Supplier Footprint: SOT-23-5; JLCPCB Part Class: Extended Part; Datasheet: https://www.ti.com/cn/lit/ds/symlink/sn74lvc1g08.pdf; Supplier: LCSC; Logic Type: 与门; Number of Gates: 1; Voltage - Supply: 1.65V~5.5V; Quiescent Current: 10uA; Current - Output Low(IOL): 32mA; Current - Output High(IOH): 32mA; Input Logic Level - High: 2V；1.7V; Input Logic Level - Low: 800mV；700mV; Output Logic Level - High: 1.9V；2.3V；1.2V；3.8V; Output Logic Level - Low: 550mV；300mV；450mV; Series: 74LVC系列; Propagation Delay: 4ns@5V,50pF; Operating Temperature: -40℃~+125℃; Inputs per Gates: 2; Features: 局部关断模式；过压容忍输入；带电插入保护；后驱动保护; Catalog UUID: bc9749d59c264b90888987196d1a86c0; DNP: false
U25-U30 = TPS1H200AQDGNRQ1: 类型:高侧开关;通道数:1;输入控制逻辑:高电平有效;工作电压:3.4V~40V;最大连续电流:2.5A;导通电阻:200mΩ;; LCSC Part Name: 40V单通道智能高侧开关; Supplier Part: C2653785; Manufacturer: TI(德州仪器); Supplier Footprint: EMSOP-8-EP; JLCPCB Part Class: Extended Part; Datasheet: https://www.ti.com/cn/lit/ds/symlink/tps1h200a-q1.pdf; Supplier: LCSC; Type: 高侧开关; Number of Channels: 1; Control Input Logic: 高电平有效; Voltage - Supply: 3.4V~40V; Maximum Continuous Current: 2.5A; RDS(on): 200mΩ; Features: 短路保护；过流保护；过温保护；集成电荷泵；反向电压保护；欠压锁定; Operating Temperature	-: -40℃~+125℃; Catalog UUID: 0a29a9f3b01a4c4594a0419ccec766f6; DNP: false
C51 = CL10B683KB8NNNC: 容值:68nF;精度:±10%;额定电压:50V;温度系数:X7R;; LCSC Part Name: 68nF ±10% 50V; Supplier Part: C31658; Manufacturer: SAMSUNG(三星); Supplier Footprint: 0603; JLCPCB Part Class: Extended Part; Datasheet: https://item.szlcsc.com/datasheet/CL10B683KB8NNNC/32617.html; Supplier: LCSC; Tolerance: ±10%; Voltage Rating: 50V; Temperature Coefficient: X7R; Catalog UUID: ba2a68f4044545b79461e8d736746820; DNP: false
C52 = CL10B224KA8NNNC: 容值:220nF;精度:±10%;额定电压:25V;温度系数:X7R;; LCSC Part Name: 220nF ±10% 25V; Supplier Part: C21120; Manufacturer: SAMSUNG(三星); Supplier Footprint: 0603; JLCPCB Part Class: Basic Part; Datasheet: https://item.szlcsc.com/datasheet/CL10B224KA8NNNC/21832.html; Supplier: LCSC; Tolerance: ±10%; Voltage Rating: 25V; Temperature Coefficient: X7R; Catalog UUID: a744235dbf374602b2efc75e41a2a614; DNP: false
C53 = GRM188R72A222KA01D: 容值:2.2nF;精度:±10%;额定电压:100V;温度系数:X7R;; LCSC Part Name: 2.2nF ±10% 100V; Supplier Part: C469538; Manufacturer: muRata(村田); Supplier Footprint: 0603; JLCPCB Part Class: Extended Part; Datasheet: https://item.szlcsc.com/datasheet/GRM188R72A222KA01D/475703.html; Supplier: LCSC; Tolerance: ±10%; Voltage Rating: 100V; Temperature Coefficient: X7R; Catalog UUID: a2e0650803b84eb0b0637f4e23d0eccf; DNP: false
C54 = EEEFK1V101P: 容值:100uF;精度:±20%;额定电压:35V;纹波电流:450mA@120Hz;等效串联电阻(ESR):-;; LCSC Part Name: 100uF ±20% 35V; Supplier Part: C128462; Manufacturer: PANASONIC(松下); Supplier Footprint: SMD,D8xL10.2mm; JLCPCB Part Class: Extended Part; Datasheet: https://item.szlcsc.com/datasheet/EEEFK1V101P/139747.html; Supplier: LCSC; Tolerance: ±20%; Voltage Rating: 35V; Ripple Current: 450mA@120Hz; Diameter: 8mm; Height - Seated (Max): 10.5mm; Lifetime: 5000hrs@105℃; Operating Temperature: -55℃~+105℃; Polarity type: 有极性; Catalog UUID: e204167d4db84cf48fccf8ebca82b8f7; DNP: false
D1 = SMCJ24CA: 反向截止电压(Vrwm):24V;最大钳位电压:38.9V;峰值脉冲电流(Ipp):38.6A;击穿电压:26.7V;; Supplier Part: C356780; Manufacturer: JJW(捷捷微); Supplier Footprint: SMC(DO-214AB); JLCPCB Part Class: Extended Part; Datasheet: https://atta.szlcsc.com/upload/public/pdf/source/20181226/C356793_C1FF0BB4994669FE0B6214A04E00432E.pdf; Supplier: LCSC; Reverse Stand-Off Voltage (Vrwm): 24V; Maximum Clamping Voltage: 38.9V; Peak Pulse Current (Ipp): 38.6A; Breakdown Voltage: 26.7V; Type: TVS; Catalog UUID: b4fe0b66e3a14387b7fde5540491490d; DNP: false
D2 = SMBJ18CA: 极性:双向;反向截止电压(Vrwm):18V;钳位电压:29.2V;峰值脉冲电流(Ipp):20.6A;峰值脉冲功率(Ppp):600W@10/1000us;击穿电压(VBR):20V;; Supplier Part: C330065; Manufacturer: JJW(捷捷微); Supplier Footprint: SMB; JLCPCB Part Class: Extended Part; Datasheet: https://item.szlcsc.com/datasheet/SMBJ18CA/309757.html; Supplier: LCSC; Polarity: 双向; Reverse Stand-Off Voltage (Vrwm): 18V; Clamping Voltage: 29.2V; Peak Pulse Current (Ipp): 20.6A; Peak Pulse Power Dissipation (Ppp): 600W@10/1000us; Voltage - Breakdown: 20V; Reverse Leakage Current (Ir): 1uA; Number of Channels: 单路; Operating Temperature: -55℃~+150℃; Type: TVS; Catalog UUID: a0d521c217ae4c6098b43e36b7af1eb7; DNP: false
D3 = SS54_C22452: 二极管配置:独立式;正向压降(Vf):550mV@5A;直流反向耐压(Vr):40V;整流电流:5A;; LCSC Part Name: 电压:40V 电流:5A; Supplier Part: C22452; Manufacturer: MDD(辰达半导体); Supplier Footprint: SMA(DO-214AC); JLCPCB Part Class: Basic Part; Datasheet: https://item.szlcsc.com/datasheet/SS54/23178.html; Supplier: LCSC; Diode Configuration: 独立式; Voltage - Forward(Vf@If): 550mV@5A; Voltage - DC Reverse(Vr): 40V; Current - Rectified: 5A; Reverse Leakage Current (Ir): 1mA@40V; Operating Junction Temperature Range: -55℃~+125℃; Catalog UUID: 7e4971a287384663bb1defa327c587af; DNP: false; Engineering Note: Read-back library pin1=A pin2=K: cathode to protected bus
J1 = 430450227: 插针结构:2x1P;间距:3mm;安装方式:直插;参考系列:Micro-Fit(MX 3.0);总PIN数:2P;排数:2;每排PIN数:1;行距:3mm;额定电流:8.5A;触头材质:黄铜;触头镀层:锡;工作温度:-40℃~+105℃;; LCSC Part Name: 2x1P 间距:3mm 直插 系列:Micro-Fit(MX 3.0); Supplier Part: C585475; Manufacturer: MOLEX; Supplier Footprint: 插件,P=3mm; JLCPCB Part Class: Extended Part; Datasheet: https://www.molex.com/content/dam/molex/molex-dot-com/products/automated/en-us/salesdrawingpdf/430/43045/430450227_sd.pdf?inline\; Supplier: LCSC; Pins Structure: 2x1P; Pitch: 3mm; Mounting Type: 直插; Reference Series: Micro-Fit(MX 3.0); Number of Pins: 2P; Number of Rows: 2; Number of PINs Per Row: 1; Row Spacing: 3mm; Current Rating: 8.5A; Contact Material: 黄铜; Contact Plating: 锡; Operating Temperature: -40℃~+105℃; Voltage Rating: 600V; Flame Retardant Rating: UL94V-0; Supplementary Features: 带柱; Color: 黑色; Z-Height of the Board: 9.91mm; X-Length of Bottom Edge on Board (Spacing Line): 6.65mm; Y-Width of Bottom Edge on Board: 8.77mm; Catalog UUID: 41aff8450efa4f0e9ca776715d9fbc70; DNP: false; Engineering Note: Ignition-switched input, external 5A fuse close to vehicle takeoff
Q1 Q2 = BSC040N10NS5: 数量:1个N沟道;漏源电压(Vdss):100V;连续漏极电流(Id):86A;导通电阻(RDS(on)):4mΩ@10V;耗散功率(Pd):139W;阈值电压(Vgs(th)):3.8V;; LCSC Part Name: 耐压:100V 电流:86A; Supplier Part: C534334; Manufacturer: Infineon(英飞凌); Supplier Footprint: TDSON-8(5x6); JLCPCB Part Class: Extended Part; Datasheet: https://item.szlcsc.com/datasheet/BSC040N10NS5/554718.html; Supplier: LCSC; Number: 1个N沟道; Drain to Source Voltage: 100V; Current - Continuous Drain(Id): 86A; RDS(on): 4mΩ@10V; Pd - Power Dissipation: 139W; Gate Threshold Voltage (Vgs(th)): 3.8V; Gate Charge(Qg): 72nC@10V; Input Capacitance(Ciss): 5.3nF; Reverse Transfer Capacitance (Crss@Vds): 49pF; Operating Temperature: -55℃~+150℃; Catalog UUID: 8e0081446bf24ac99a8a347a0ade67d8; DNP: false
R119 = WSL25122L000FEA18: 电阻类型:-;阻值:2mΩ;精度:±1%;功率:2W;温度系数:±275ppm/℃;; LCSC Part Name: 2mΩ ±1% 2W; Supplier Part: C844691; Manufacturer: VISHAY(威世); Supplier Footprint: 2512; JLCPCB Part Class: Extended Part; Datasheet: https://item.szlcsc.com/datasheet/WSL25122L000FEA18/904265.html; Supplier: LCSC; Tolerance: ±1%; Power(Watts): 2W; Temperature Coefficient: ±275ppm/℃; Operating Temperature: -65℃~+170℃; Catalog UUID: 7887508d05cd4d238b9c7ef1b864a66d; DNP: false; Engineering Note: 2mOhm 2W; independent Kelvin sense routing required
R120 = 0603WAF1073T5E: 电阻类型:厚膜电阻;阻值:107kΩ;精度:±1%;功率:100mW;工作电压:75V;温度系数:±100ppm/℃;; LCSC Part Name: 厚膜电阻 107kΩ ±1%; Supplier Part: C14889; Manufacturer: UNI-ROYAL(厚声); Supplier Footprint: 0603; JLCPCB Part Class: Extended Part; Datasheet: https://item.szlcsc.com/datasheet/0603WAF1073T5E/15561.html; Supplier: LCSC; Type: 厚膜电阻; Tolerance: ±1%; Power(Watts): 100mW; Voltage-Supply(Max): 75V; Temperature Coefficient: ±100ppm/℃; Operating Temperature: -55℃~+155℃; Catalog UUID: d8d73bb08ec2491ba7138fdb11027eeb; DNP: false
R121 = 0603WAF9091T5E: 电阻类型:厚膜电阻;阻值:9.09kΩ;精度:±1%;功率:100mW;工作电压:75V;温度系数:±100ppm/℃;; LCSC Part Name: 9.09kΩ ±1% 100mW 厚膜电阻; Supplier Part: C23125; Manufacturer: UNI-ROYAL(厚声); Supplier Footprint: 0603; JLCPCB Part Class: Extended Part; Datasheet: https://item.szlcsc.com/datasheet/0603WAF9091T5E/23852.html; Supplier: LCSC; Type: 厚膜电阻; Tolerance: ±1%; Power(Watts): 100mW; Voltage-Supply(Max): 75V; Temperature Coefficient: ±100ppm/℃; Operating Temperature: -55℃~+155℃; Catalog UUID: ac2b99c4284a4ffbb99d04b6b551c155; DNP: false
R122 = 0603WAF9532T5E: 电阻类型:厚膜电阻;阻值:95.3kΩ;精度:±1%;功率:100mW;最大工作电压:75V;温度系数:±100ppm/℃;; LCSC Part Name: 95.3kΩ ±1% 100mW 厚膜电阻; Supplier Part: C23267; Manufacturer: UNI-ROYAL(厚声); Supplier Footprint: 0603; JLCPCB Part Class: Extended Part; Datasheet: https://atta.szlcsc.com/upload/public/pdf/source/20200306/C422600_1E6D84923E4A46A82E41ADD87F860B5C.pdf; Supplier: LCSC; Type: 厚膜电阻; Tolerance: ±1%; Power(Watts): 100mW; Overload Voltage (Max): 75V; Temperature Coefficient: ±100ppm/℃; Operating Temperature Range: -55℃~+155℃; Catalog UUID: 359836b82a644a2c8e28d5abc9082060; DNP: false
R123 R127 = 0603WAF3321T5E: 电阻类型:厚膜电阻;阻值:3.32kΩ;精度:±1%;功率:100mW;工作电压:75V;温度系数:±100ppm/℃;; LCSC Part Name: 厚膜电阻 3.32kΩ ±1%; Supplier Part: C22995; Manufacturer: UNI-ROYAL(厚声); Supplier Footprint: 0603; JLCPCB Part Class: Extended Part; Datasheet: https://item.szlcsc.com/datasheet/0603WAF3321T5E/23722.html; Supplier: LCSC; Type: 厚膜电阻; Tolerance: ±1%; Power(Watts): 100mW; Voltage-Supply(Max): 75V; Temperature Coefficient: ±100ppm/℃; Operating Temperature: -55℃~+155℃; Catalog UUID: b1316b2ffdad4342a6dc9bccbe43b253; DNP: false
R124 = 0603WAF750JT5E: 电阻类型:厚膜电阻;阻值:75Ω;精度:±1%;功率:100mW;工作电压:75V;温度系数:±100ppm/℃;; LCSC Part Name: 厚膜电阻 75Ω ±1%; Supplier Part: C4275; Manufacturer: UNI-ROYAL(厚声); Supplier Footprint: 0603; JLCPCB Part Class: Basic Part; Datasheet: https://item.szlcsc.com/datasheet/0603WAF750JT5E/4682.html; Supplier: LCSC; Type: 厚膜电阻; Tolerance: ±1%; Power(Watts): 100mW; Voltage-Supply(Max): 75V; Temperature Coefficient: ±100ppm/℃; Operating Temperature: -55℃~+155℃; Catalog UUID: 82f59bf5170545039c62a79ef9b92a0a; DNP: false
R125 R128 = 0603WAF1001T5E: 电阻类型:厚膜电阻;阻值:1kΩ;精度:±1%;功率:100mW;工作电压:75V;温度系数:±100ppm/℃;; LCSC Part Name: 1kΩ ±1% 100mW 厚膜电阻; Supplier Part: C21190; Manufacturer: UNI-ROYAL(厚声); Supplier Footprint: 0603; JLCPCB Part Class: Basic Part; Datasheet: https://item.szlcsc.com/datasheet/0603WAF1001T5E/21904.html; Supplier: LCSC; Type: 厚膜电阻; Tolerance: ±1%; Power(Watts): 100mW; Voltage-Supply(Max): 75V; Temperature Coefficient: ±100ppm/℃; Operating Temperature: -55℃~+155℃; Catalog UUID: 18db11499a04403ba8c98e2f7a687fbc; DNP: false
R126 = 0603WAF5622T5E: 电阻类型:厚膜电阻;阻值:56.2kΩ;精度:±1%;功率:100mW;工作电压:75V;温度系数:±100ppm/℃;; LCSC Part Name: 厚膜电阻 56.2kΩ ±1%; Supplier Part: C23080; Manufacturer: UNI-ROYAL(厚声); Supplier Footprint: 0603; JLCPCB Part Class: Extended Part; Datasheet: https://item.szlcsc.com/datasheet/0603WAF5622T5E/23807.html; Supplier: LCSC; Type: 厚膜电阻; Tolerance: ±1%; Power(Watts): 100mW; Voltage-Supply(Max): 75V; Temperature Coefficient: ±100ppm/℃; Operating Temperature: -55℃~+155℃; Catalog UUID: 7cfaa26312064013bca9d4249c7d648d; DNP: false
U31 = LM74900QRGERQ1: LM74900-Q1 具有断路器、欠压和过压保护以及故障输出功能的汽车类理想二极管; LCSC Part Name: 具备断路器、欠压和过压保护以及故障输出功能的汽车用理想二极管; Supplier Part: C20345498; Manufacturer: TI(德州仪器); Supplier Footprint: VQFN-24(4x4); JLCPCB Part Class: Extended Part; Datasheet: https://item.szlcsc.com/datasheet/LM74900QRGERQ1/21671025.html; Supplier: LCSC; Catalog UUID: c0378d4b7dfc443eb0364950065541ad; DNP: false; Engineering Note: EP/RTN floating, never tied GND; common-drain power MOS topology; SLEEP_OV to VS for cutoff

## Nets
3V3: C1.1 C3.1 C4.1 C17.1 C19.1 C20.1 R5.1 R6.1 R7.1 R8.1 R9.1 R53.1 R54.1 R55.1 R129.1 U1.3(3V3) U5.2(3V3) U6.8(VCC) U7.8(VCC) U8.8(VCC) U9.8(VCC) U10.8(VCC) U11.8(VCC) U12.14(VCC) U16.14(VCC) U19.5(VCC) U20.5(VCC) U21.5(VCC) U22.5(VCC) U23.5(VCC) U24.5(VCC) ; also on sheet 5 6 7 8 9 10 11 12
5V_BUCK: BZ1.1 D4.2(K) ; also on sheet 9
12V_PROTECTED: C54.1 D2.1(K) D3.2(K) Q2.1(S) Q2.2(S) Q2.3(S) U25.8(VS) U26.8(VS) U27.8(VS) U28.8(VS) U29.8(VS) U30.8(VS) U31.15(OUT) ; also on sheet 9 10 11 12
12V_RAW: C56.1 D1.1(K) J1.1 Q1.1(S) Q1.2(S) Q1.3(S) U31.2(A)
GND: C1.2 C2.2 C3.2 C4.2 C17.2 C18.2 C19.2 C20.2 C51.2 C53.2 C54.2 C55.2 C56.2 C76.2 C77.2 D1.2(A) D2.2(A) D3.1(A) D5.2(A) D6.2(A) D7.2(A) D8.2(A) D9.2(A) D10.2(A) D11.2(A) D12.2(A) D13.2(A) D14.2(A) D15.2(A) D16.2(A) J1.2 J5.2 J6.2 J7.2 J8.2 J9.2 J10.2 J11.3 J11.5 J15.3 J15.5 Q4.2(S) R10.2 R11.2 R12.2 R56.2 R57.2 R58.2 R59.2 R61.2 R121.2 R123.2 R126.2 R127.2 U1.1(GND) U1.2(GND) U1.11(GND) U1.14(GND) U1.36(GND) U1.37(GND) U1.38(GND) U1.39(GND) U1.40(GND) U1.41(GND) U1.42(GND) U1.43(GND) U1.44(GND) U1.45(GND) U1.46(GND) U1.47(GND) U1.48(GND) U1.49(GND) U1.50(GND) U1.51(GND) U1.52(GND) U1.53(GND) U5.1(GND) U5.40(GND) U5.41(EP) U6.5(GND) U7.5(GND) U8.5(GND) U9.5(GND) U10.5(GND) U11.5(GND) U12.1(1OE) U12.4(2OE) U12.7(GND) U12.10(3OE) U16.1(1OE) U16.4(2OE) U16.7(GND) U16.10(3OE) U19.3(GND) U20.3(GND) U21.3(GND) U22.3(GND) U23.3(GND) U24.3(GND) U25.6(GND) U25.9(EP) U26.6(GND) U26.9(EP) U27.6(GND) U27.9(EP) U28.6(GND) U28.9(EP) U29.6(GND) U29.9(EP) U30.6(GND) U30.9(EP) U31.13(GND) ; also on sheet 5 6 7 8 9 10 11 12
BL_A: D13.1(K) J9.3 U10.6(A) ; also on sheet 12
BL_B: D14.1(K) J9.4 U10.7(B) ; also on sheet 12
BL_DE_CMD: R58.1 U5.6(IO6) U23.1(A)
BL_DE_HW: U10.2(RE#) U10.3(DE) U23.4(Y)
BL_ILIM: U29.4(CL) ; also on sheet 12
BL_POWER_EN: U29.1(IN) U29.2(DIAG_EN) ; also on sheet 12
BL_RETRY: U29.5(DELAY) ; also on sheet 12
BL_RO: U10.1(R) ; also on sheet 12
BL_RX: U5.4(IO4) ; also on sheet 12
BL_TX: U5.5(IO5) U10.4(D)
BL_VPROBE: J9.1 U29.7(OUT) ; also on sheet 12
BR_A: D15.1(K) J10.3 U11.6(A) ; also on sheet 12
BR_B: D16.1(K) J10.4 U11.7(B) ; also on sheet 12
BR_DE_CMD: R59.1 U5.10(IO17) U24.1(A)
BR_DE_HW: U11.2(RE#) U11.3(DE) U24.4(Y)
BR_ILIM: U30.4(CL) ; also on sheet 12
BR_POWER_EN: U30.1(IN) U30.2(DIAG_EN) ; also on sheet 12
BR_RETRY: U30.5(DELAY) ; also on sheet 12
BR_RO: U11.1(R) ; also on sheet 12
BR_RX: U5.8(IO15) ; also on sheet 12
BR_TX: U5.9(IO16) U11.4(D)
BR_VPROBE: J10.1 U30.7(OUT) ; also on sheet 12
BRAKE_ARM: R56.1 U5.23(IO21) U23.2(B) U24.2(B) ; also on sheet 12
BRAKE_BOOT: J15.6 R55.2 U5.27(IO0)
BRAKE_CS: R51.2 U5.18(IO10)
BRAKE_CS_B: R51.1 U16.8(3Y)
BRAKE_EN: C18.1 J15.4 R54.2 U5.3(EN)
BRAKE_MISO: U5.21(IO13) U16.12(4A)
BRAKE_MISO_B: R52.1 U16.11(4Y)
BRAKE_MOSI: R50.2 U5.19(IO11)
BRAKE_MOSI_B: R50.1 U16.6(2Y)
BRAKE_SCK: R49.2 U5.20(IO12)
BRAKE_SCK_B: R49.1 U16.3(1Y)
BRAKE_USB_DM: J15.1 U5.13(IO19)
BRAKE_USB_DP: J15.2 U5.14(IO20)
BUZZER_CMD: R60.1 U5.7(IO7)
BUZZER_GATE: Q4.1(G) R60.2 R61.1
BUZZER_LOW: BZ1.2 D4.1(A) Q4.3(D)
CS_BRAKE: R53.2 U16.9(3A) U16.13(4OE) ; also on sheet 8
CS_FL: R5.2 U12.9(3A) U12.13(4OE) ; also on sheet 8
CS_PLUS: R124.2 U31.20(CS+)
DGATE: Q1.4(G) U31.1(DGATE)
DVDT_RC: C53.1 R128.2
FL_A: D5.1(K) J5.3 U6.6(A) ; also on sheet 10
FL_ARM: R10.1 U1.30(RXD0) U19.2(B) ; also on sheet 10
FL_B: D6.1(K) J5.4 U6.7(B) ; also on sheet 10
FL_BOOT: J11.6 R7.2 U1.23(IO9)
FL_CS: R3.2 U1.18(IO4)
FL_CS_B: R3.1 U12.8(3Y)
FL_DE_CMD: R11.1 U1.21(IO7) U19.1(A)
FL_DE_HW: U6.2(RE#) U6.3(DE) U19.4(Y)
FL_EN: C2.1 J11.4 R6.2 U1.8(EN)
FL_ILIM: U25.4(CL) ; also on sheet 10
FL_MISO: U1.6(IO3) U12.12(4A)
FL_MISO_B: R4.1 U12.11(4Y)
FL_MOSI: R2.2 U1.13(IO1)
FL_MOSI_B: R2.1 U12.6(2Y)
FL_POWER_EN: U25.1(IN) U25.2(DIAG_EN) ; also on sheet 10
FL_RETRY: U25.5(DELAY) ; also on sheet 10
FL_RO: U6.1(R) ; also on sheet 10
FL_RX: U1.16(IO10) ; also on sheet 10
FL_SCK: R1.2 U1.12(IO0)
FL_SCK_B: R1.1 U12.3(1Y)
FL_STRAP2: R9.2 U1.5(IO2)
FL_STRAP8: R8.2 U1.22(IO8)
FL_TX: U1.20(IO6) U6.4(D)
FL_USB_DM: C76.1 J11.1 R134.2
FL_USB_DM_MCU: R134.1 U1.26(IO18)
FL_USB_DP: C77.1 J11.2 R135.2
FL_USB_DP_MCU: R135.1 U1.27(IO19)
FL_VPROBE: J5.1 U25.7(OUT) ; also on sheet 10
FR_A: D7.1(K) J6.3 U7.6(A) ; also on sheet 10
FR_ARM: U20.2(B) ; also on sheet 5 10
FR_B: D8.1(K) J6.4 U7.7(B) ; also on sheet 10
FR_DE_CMD: U20.1(A) ; also on sheet 5
FR_DE_HW: U7.2(RE#) U7.3(DE) U20.4(Y)
FR_ILIM: U26.4(CL) ; also on sheet 10
FR_POWER_EN: U26.1(IN) U26.2(DIAG_EN) ; also on sheet 10
FR_RETRY: U26.5(DELAY) ; also on sheet 10
FR_RO: U7.1(R) ; also on sheet 10
FR_TX: U7.4(D) ; also on sheet 5
FR_VPROBE: J6.1 U26.7(OUT) ; also on sheet 10
HGATE: Q2.4(G) R128.1 U31.14(HGATE)
HOST_MISO_INT: R4.2 R52.2 ; also on sheet 5 6 7 8
HOST_MOSI: U12.5(2A) U16.5(2A) ; also on sheet 5 6 7 8
HOST_SCK: U12.2(1A) U16.2(1A) ; also on sheet 5 6 7 8
IMON: R127.1 U31.10(IMON)
ISCP: R125.2 U31.18(ISCP)
MAIN_CAP: C52.1 U31.23(CAP)
MAIN_FAULT_N: R129.2 U5.38(IO2) U31.12(FLT#)
MAIN_N1: C52.2 C55.1 Q1.5(D) Q1.6(D) Q1.7(D) Q1.8(D) R119.1 R124.1 R125.1 U31.6(EN) U31.7(SLEEP#) U31.16(SLEEP_OV) U31.22(VS) U31.24(C)
MAIN_N2: Q2.5(D) Q2.6(D) Q2.7(D) Q2.8(D) R119.2 U31.19(CS-)
OCP_ILIM: R126.1 U31.11(ILIM)
OCP_TMR: C51.1 U31.9(TMR)
OVLO: R122.2 R123.1 U31.5(OV)
PORT_FAULT_N: U5.39(IO1) U25.3(FAULT#) U26.3(FAULT#) U27.3(FAULT#) U28.3(FAULT#) U29.3(FAULT#) U30.3(FAULT#) ; also on sheet 12
READY_BRAKE: R57.1 U5.22(IO14) ; also on sheet 8
READY_FL: R12.1 U1.19(IO5) ; also on sheet 8
RL_A: D9.1(K) J7.3 U8.6(A) ; also on sheet 11
RL_ARM: U21.2(B) ; also on sheet 6 11
RL_B: D10.1(K) J7.4 U8.7(B) ; also on sheet 11
RL_DE_CMD: U21.1(A) ; also on sheet 6
RL_DE_HW: U8.2(RE#) U8.3(DE) U21.4(Y)
RL_ILIM: U27.4(CL) ; also on sheet 11
RL_POWER_EN: U27.1(IN) U27.2(DIAG_EN) ; also on sheet 11
RL_RETRY: U27.5(DELAY) ; also on sheet 11
RL_RO: U8.1(R) ; also on sheet 11
RL_TX: U8.4(D) ; also on sheet 6
RL_VPROBE: J7.1 U27.7(OUT) ; also on sheet 11
RR_A: D11.1(K) J8.3 U9.6(A) ; also on sheet 11
RR_ARM: U22.2(B) ; also on sheet 7 11
RR_B: D12.1(K) J8.4 U9.7(B) ; also on sheet 11
RR_DE_CMD: U22.1(A) ; also on sheet 7
RR_DE_HW: U9.2(RE#) U9.3(DE) U22.4(Y)
RR_ILIM: U28.4(CL) ; also on sheet 11
RR_POWER_EN: U28.1(IN) U28.2(DIAG_EN) ; also on sheet 11
RR_RETRY: U28.5(DELAY) ; also on sheet 11
RR_RO: U9.1(R) ; also on sheet 11
RR_TX: U9.4(D) ; also on sheet 7
RR_VPROBE: J8.1 U28.7(OUT) ; also on sheet 11
UV_SW: R120.1 R122.1 U31.3(SW)
UVLO: R120.2 R121.1 U31.4(UVLO)

Not connected (* = marked no-connect by the designer): U1 4(NC)* 7(NC)* 9(NC)* 10(NC)* 15(NC)* 17(NC)* 24(NC)* 25(NC)* 28(NC)* 29(NC)* 31(TXD0)* 32(NC)* 33(NC)* 34(NC)* 35(NC)*; U5 11(IO18)* 12(IO8)* 15(IO3)* 16(IO46)* 17(IO9)* 24(IO47)* 25(IO48)* 26(IO45)* 28(IO35)* 29(IO36)* 30(IO37)* 31(IO38)* 32(IO39)* 33(IO40)* 34(IO41)* 35(IO42)* 36(RXD0)* 37(TXD0)*; U31 8(NC)* 17(NC)* 21(NC)* 25(EPAD)*

## Notes on the sheets
sheet 1
- 六接口底板 V0.1 | 工程样机草案 · 实物未验证
- 候选硬件：未启用 Approved profile
  跨页信号使用同名网络端口；两条3V3禁止并联
  图纸、网表与PCB须分别审查后才能制造
sheet 2
- 六接口底板 V0.1 | 工程样机草案 · 实物未验证
- 候选硬件：未启用 Approved profile
  跨页信号使用同名网络端口；两条3V3禁止并联
  图纸、网表与PCB须分别审查后才能制造
sheet 3
- 六接口底板 V0.1 | 工程样机草案 · 实物未验证
- 六接口底板 V0.1 | 工程样机草案 · 实物未验证
- 六接口底板 V0.1 | 工程样机草案 · 实物未验证
- 候选硬件：未启用 Approved profile
  跨页信号使用同名网络端口；两条3V3禁止并联
  图纸、网表与PCB须分别审查后才能制造
- 候选硬件：未启用 Approved profile
  跨页信号使用同名网络端口；两条3V3禁止并联
  图纸、网表与PCB须分别审查后才能制造
- 候选硬件：未启用 Approved profile
  跨页信号使用同名网络端口；两条3V3禁止并联
  图纸、网表与PCB须分别审查后才能制造
sheet 4
- 六接口底板 V0.1 | 工程样机草案 · 实物未验证
- 候选硬件：未启用 Approved profile
  跨页信号使用同名网络端口；两条3V3禁止并联
  图纸、网表与PCB须分别审查后才能制造
